# Altium project TM_DE_Main_REV1.0.PrjPcb (part 1 of 2)
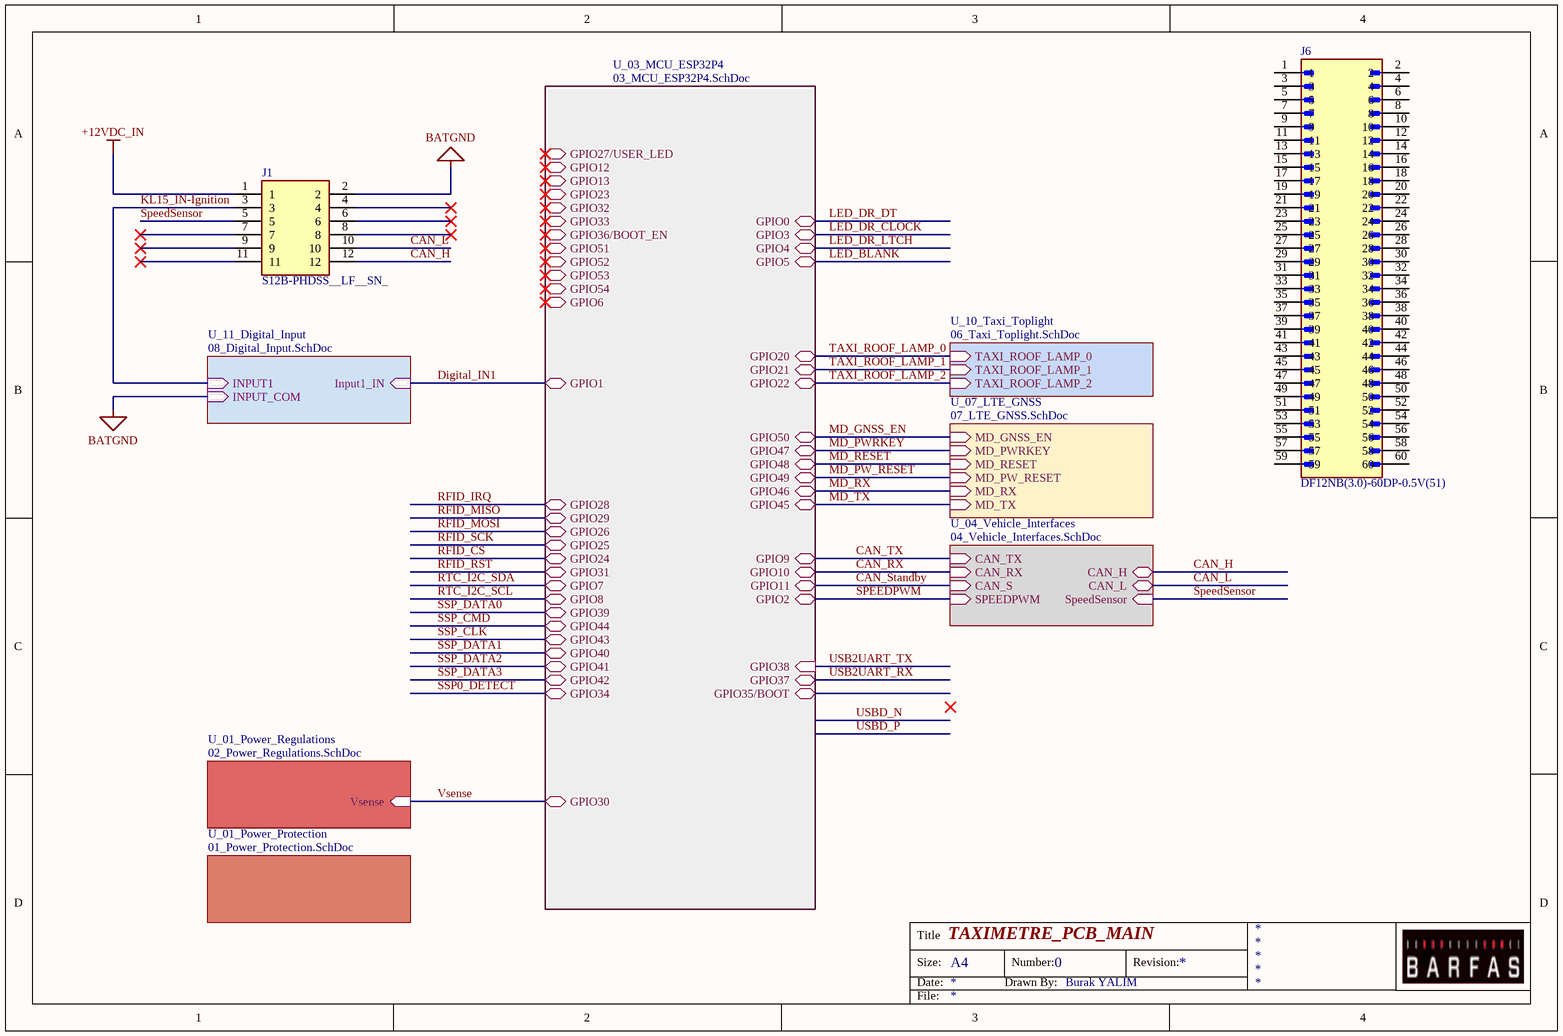
[diagram p0: TOP.SchDoc]
9 sheets, 202 parts. Net scope: hierarchical (ports join the sheet entries above them; power ports are global).
Board file: TM_DE_Main_REV1.0.PcbDoc
Sheets:
  TOP.SchDoc
    U_07_LTE_GNSS = 07_LTE_GNSS.SchDoc
    U_04_Vehicle_Interfaces = 04_Vehicle_Interfaces.SchDoc
    U_03_MCU_ESP32P4 = 03_MCU_ESP32P4.SchDoc
    U_01_Power_Protection = 01_Power_Protection.SchDoc
    U_01_Power_Regulations = 02_Power_Regulations.SchDoc
    U_10_Taxi_Toplight = 06_Taxi_Toplight.SchDoc
    U_11_Digital_Input = 08_Digital_Input.SchDoc
  05_USB_UART_Service.SchDoc

## Sheet TOP.SchDoc: TAXIMETRE_PCB_MAIN
size A4; Author: Burak YALIM; CompanyName: BARFAS; DrawnBy: Burak YALIM; DocumentNumber: 0; SheetNumber: 1; SheetTotal: 12

### Parts
J1  S12B-PHDSS__LF__SN_  [S12BPHDSSLFSN]
J6  DF12NB(3.0)-60DP-0.5V(51)  [HRS_DF12NB(3.0)-60DP-0.5V(51)]

### Sub-sheets
U_01_Power_Protection = 01_Power_Protection.SchDoc: no entries
U_01_Power_Regulations = 02_Power_Regulations.SchDoc: Vsense (in)
U_03_MCU_ESP32P4 = 03_MCU_ESP32P4.SchDoc: GPIO0 (bidir), GPIO1 (bidir), GPIO2 (bidir), GPIO3 (bidir), GPIO4 (bidir), GPIO5 (bidir), GPIO6 (bidir), GPIO7 (bidir), GPIO8 (bidir), GPIO9 (bidir), GPIO10 (bidir), GPIO11 (bidir), GPIO12 (bidir), GPIO13 (bidir), GPIO20 (bidir), GPIO21 (bidir), GPIO22 (bidir), GPIO23 (bidir), GPIO24 (bidir), GPIO25 (bidir), GPIO26 (bidir), GPIO27/USER_LED (bidir), GPIO28 (bidir), GPIO29 (bidir), GPIO30 (bidir), GPIO31 (bidir), GPIO32 (bidir), GPIO33 (bidir), GPIO34 (bidir), GPIO35/BOOT (bidir), GPIO36/BOOT_EN (bidir), GPIO37 (bidir), GPIO38 (in), GPIO39 (bidir), GPIO40 (bidir), GPIO41 (bidir), GPIO42 (bidir), GPIO43 (bidir), GPIO44 (bidir), GPIO45 (bidir), GPIO46 (bidir), GPIO47 (bidir), GPIO48 (bidir), GPIO49 (bidir), GPIO50 (bidir), GPIO51 (bidir), GPIO52 (bidir), GPIO53 (bidir), GPIO54 (bidir)
U_04_Vehicle_Interfaces = 04_Vehicle_Interfaces.SchDoc: CAN_TX (in), CAN_RX (in), CAN_S (in), SPEEDPWM (in), SpeedSensor (in), CAN_H (bidir), CAN_L (bidir)
U_07_LTE_GNSS = 07_LTE_GNSS.SchDoc: MD_GNSS_EN (in), MD_PWRKEY (in), MD_RESET (in), MD_PW_RESET (in), MD_RX (in), MD_TX (in)
U_10_Taxi_Toplight = 06_Taxi_Toplight.SchDoc: TAXI_ROOF_LAMP_0 (in), TAXI_ROOF_LAMP_1 (in), TAXI_ROOF_LAMP_2 (in)
U_11_Digital_Input = 08_Digital_Input.SchDoc: INPUT1 (in), Input1_IN (in), INPUT_COM (in)

### Nets
+12VDC_IN: J1.1
BATGND: J1.2 ; sheet U_11_Digital_Input/INPUT_COM
CAN_H: J1.10 J1.12 ; sheet U_04_Vehicle_Interfaces/CAN_H, sheet U_04_Vehicle_Interfaces/CAN_L  [also labelled CAN_L]
CAN_RX: sheet U_04_Vehicle_Interfaces/CAN_RX, sheet U_03_MCU_ESP32P4/GPIO10
CAN_Standby: sheet U_04_Vehicle_Interfaces/CAN_S, sheet U_03_MCU_ESP32P4/GPIO11
CAN_TX: sheet U_04_Vehicle_Interfaces/CAN_TX, sheet U_03_MCU_ESP32P4/GPIO9
Digital_IN1: sheet U_03_MCU_ESP32P4/GPIO1, sheet U_11_Digital_Input/Input1_IN
KL15_IN-Ignition: J1.3 ; sheet U_11_Digital_Input/INPUT1  [project net INPUT1]
MD_GNSS_EN: sheet U_07_LTE_GNSS/MD_GNSS_EN, sheet U_03_MCU_ESP32P4/GPIO50
MD_PW_RESET: sheet U_07_LTE_GNSS/MD_PW_RESET, sheet U_03_MCU_ESP32P4/GPIO49
MD_PWRKEY: sheet U_07_LTE_GNSS/MD_PWRKEY, sheet U_03_MCU_ESP32P4/GPIO47
MD_RESET: sheet U_07_LTE_GNSS/MD_RESET, sheet U_03_MCU_ESP32P4/GPIO48
MD_RX: sheet U_07_LTE_GNSS/MD_RX, sheet U_03_MCU_ESP32P4/GPIO46
MD_TX: sheet U_07_LTE_GNSS/MD_TX, sheet U_03_MCU_ESP32P4/GPIO45
SPEEDPWM: sheet U_04_Vehicle_Interfaces/SPEEDPWM, sheet U_03_MCU_ESP32P4/GPIO2
SpeedSensor: J1.5 ; sheet U_04_Vehicle_Interfaces/SpeedSensor
TAXI_ROOF_LAMP_0: sheet U_03_MCU_ESP32P4/GPIO20, sheet U_10_Taxi_Toplight/TAXI_ROOF_LAMP_0
TAXI_ROOF_LAMP_1: sheet U_03_MCU_ESP32P4/GPIO21, sheet U_10_Taxi_Toplight/TAXI_ROOF_LAMP_1
TAXI_ROOF_LAMP_2: sheet U_03_MCU_ESP32P4/GPIO22, sheet U_10_Taxi_Toplight/TAXI_ROOF_LAMP_2
Vsense: sheet U_03_MCU_ESP32P4/GPIO30, sheet U_01_Power_Regulations/Vsense

Not connected (* = marked no-connect by the designer): J1 4* 6* 7* 8* 9* 11*; J6 1 2 3 4 5 6 7 8 9 10 11 12 13 14 15 16 17 18 19 20 21 22 23 24 25 26 27 28 29 30 31 32 33 34 35 36 37 38 39 40 41 42 43 44 45 46 47 48 49 50 51 52 53 54 55 56 57 58 59 60

### Notes on the sheet
- Title
- Size:
- Date:
- A4
- Drawn By:
- Number:
- Revision:
- File:

### Library data of the parts
J1 = S12B-PHDSS__LF__SN_: Connector; Manufacturer_Name: JST (JAPAN SOLDERLESS TERMINALS); Manufacturer_Part_Number: S12B-PHDSS (LF)(SN); Datasheet Link: https://www.jst-mfg.com/product/pdf/eng/ePHD.pdf; Height: 5mm
J6 = DF12NB(3.0)-60DP-0.5V(51): 60 Position Connector Header, Outer Shroud Contacts Surface Mount Gold; MF: Hirose Electric Co Ltd; SnapEDA_Link: https://www.snapeda.com/parts/DF12NB(3.0)-60DP-0.5V(51)/Hirose/view-part/?ref=snap; Package: None; Value: *; MP: DF12NB(3.0)-60DP-0.5V(51); Check_prices: https://www.snapeda.com/parts/DF12NB(3.0)-60DP-0.5V(51)/Hirose/view-part/?ref=eda

## Sheet 07_LTE_GNSS.SchDoc: LTE_GNSS
size 420 x 297 mm; SheetNumber: 8; SheetTotal: 12
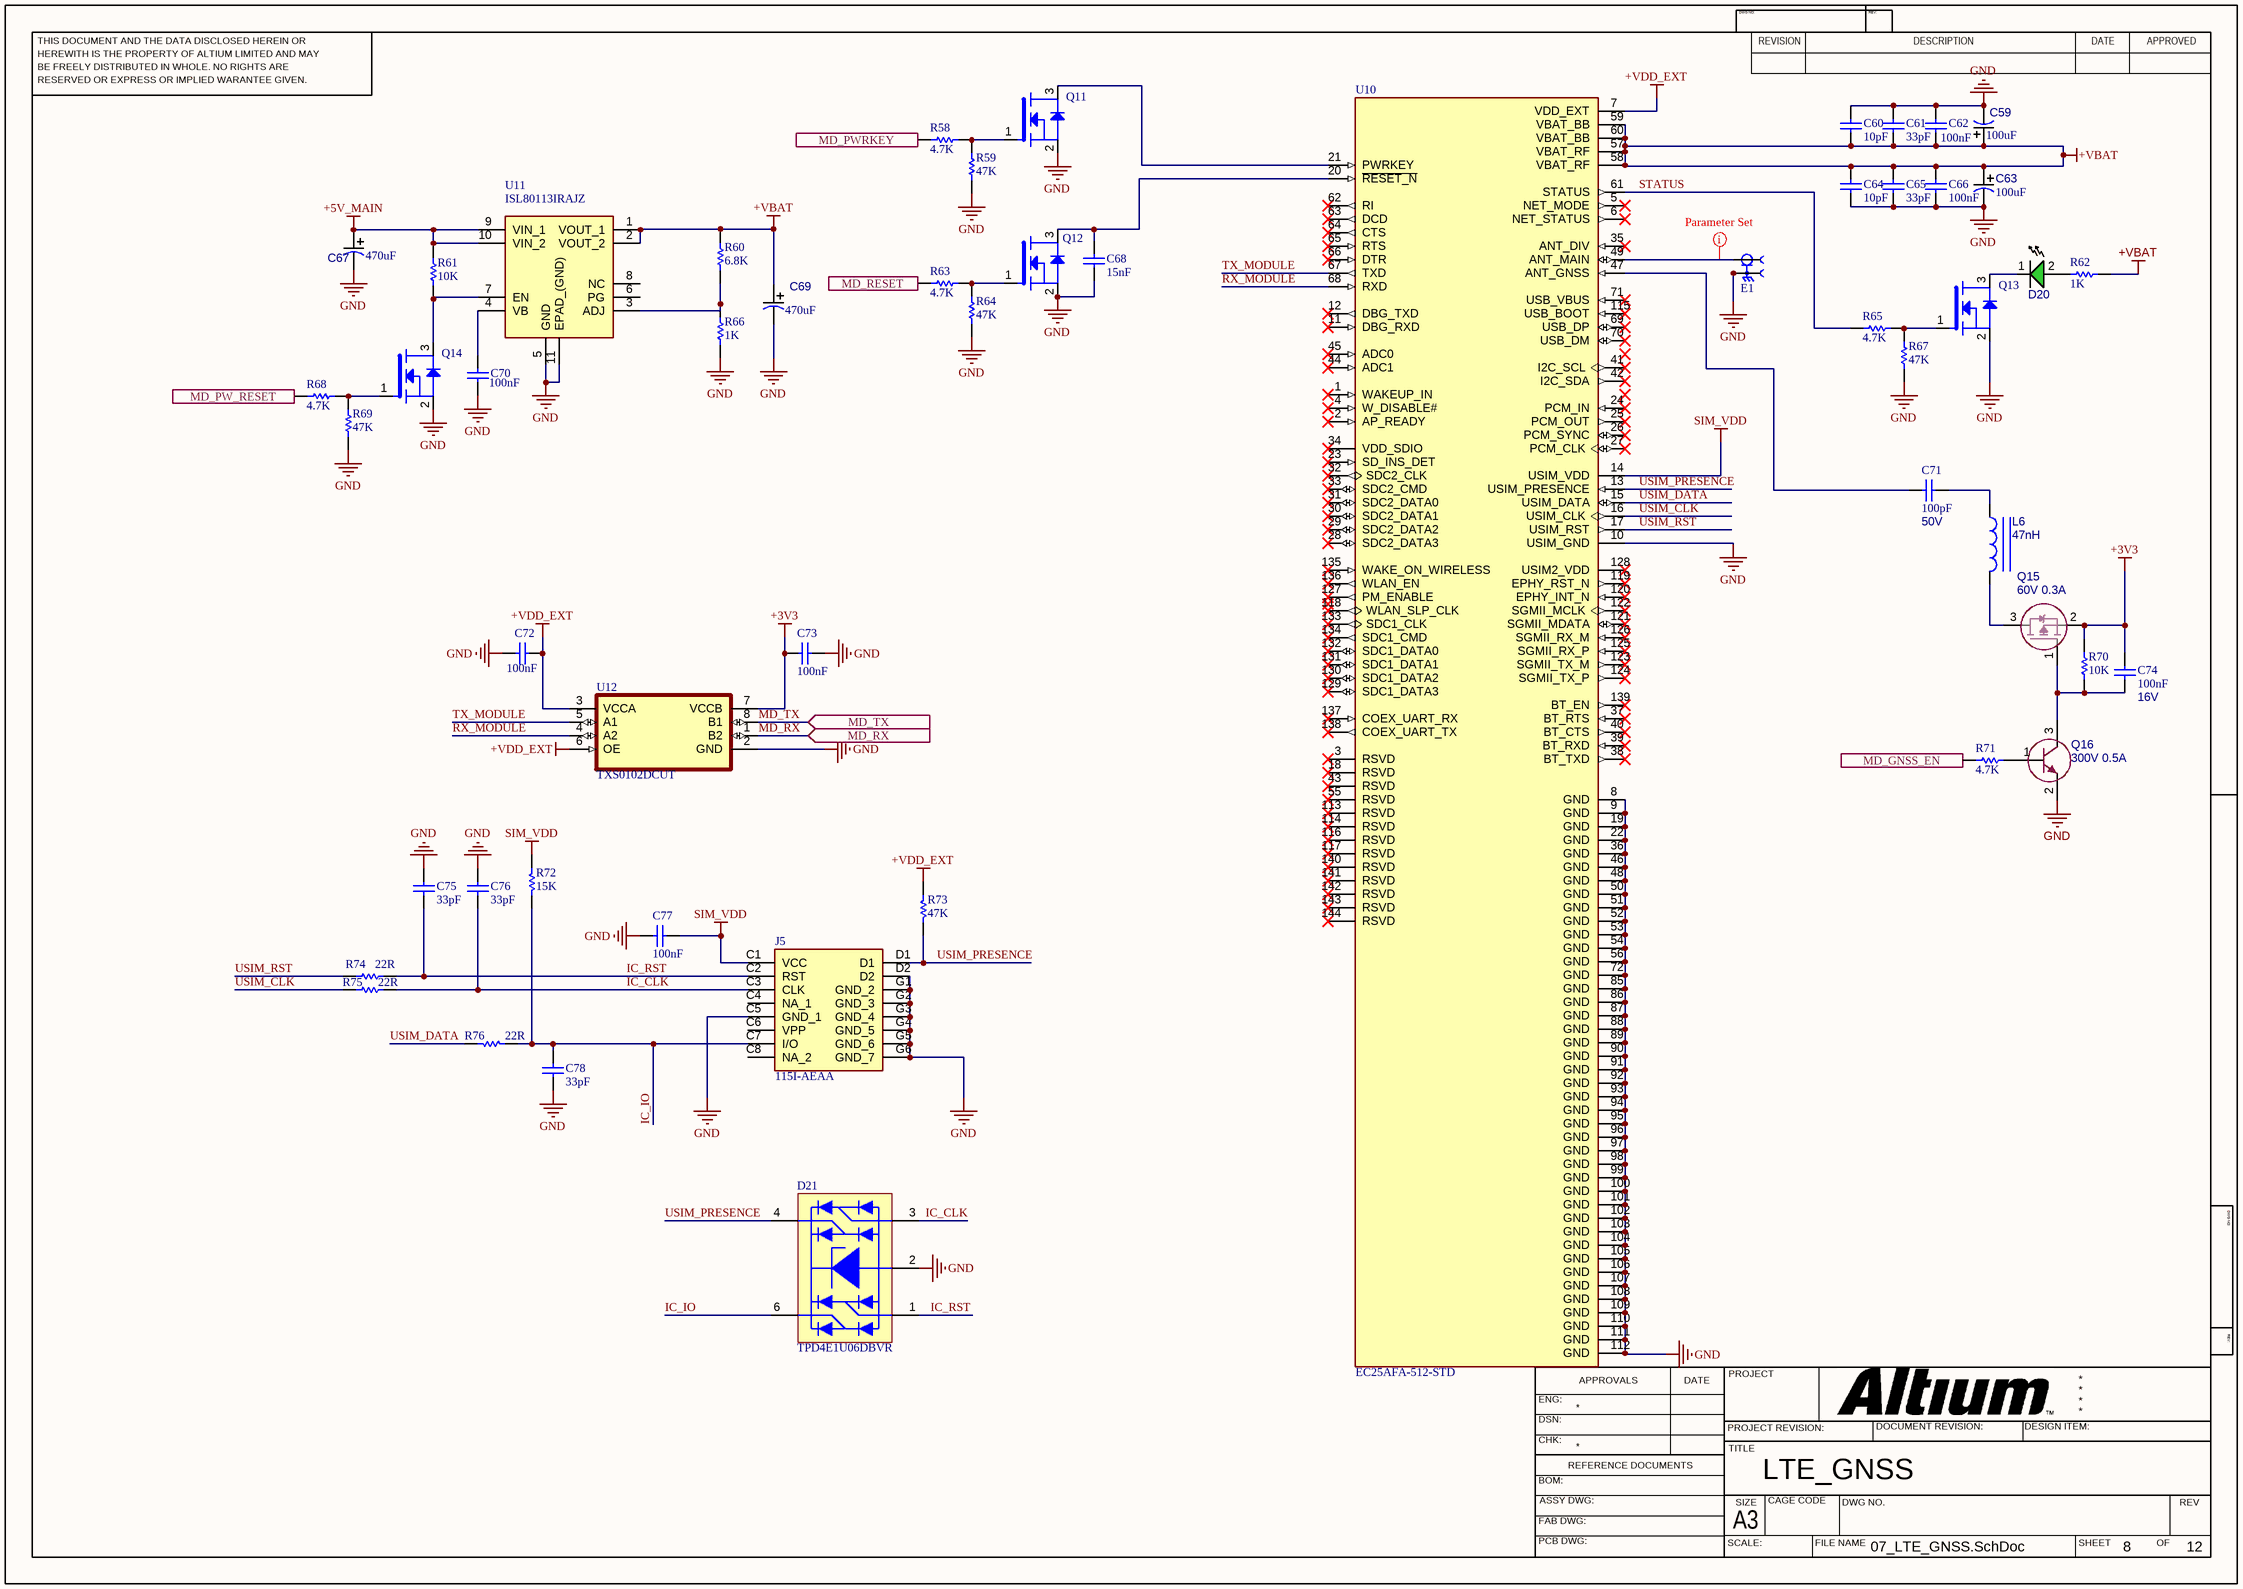
[diagram p1: 07_LTE_GNSS.SchDoc]

### Parts
C59  value 100uF  [TANTALIUM_BCASE]  (hidden comment: T491B107K006AT)
C60  value 10pF  [CAP_0603]  (hidden comment: CL10C100CB8NNNC)
C61  value 33pF  [CAP_0603]  (hidden comment: CL10C330JB8NNNC)
C62  value 100nF  [CAP_0603]  (hidden comment: CL10B104KB8NNNL)
C63  value 100uF  [TANTALIUM_BCASE]  (hidden comment: T491B107K006AT)
C64  value 10pF  [CAP_0603]  (hidden comment: CL10C100CB8NNNC)
C65  value 33pF  [CAP_0603]  (hidden comment: CL10C330JB8NNNC)
C66  value 100nF  [CAP_0603]  (hidden comment: CL10B104KB8NNNL)
C67  value 470uF  [CAP_ELEC_8X10.5 mm]  (hidden comment: MRW-016V471MF105-T/R)
C68  value 15nF  [CAP_0603]  (hidden comment: CL10B153KB85PNC)
C69  value 470uF  [CAP_ELEC_8X10.5 mm]  (hidden comment: MRW-016V471MF105-T/R)
C70  value 100nF  [CAP_0603]  (hidden comment: CL10B104KB8NNNL)
C71  value 100pF  Voltage: 50V  [CAP_0402]  (hidden comment: CC0402JRNPO9BN101)
C72  value 100nF  [CAP_0603]  (hidden comment: CL10B104KB8NNNL)
C73  value 100nF  [CAP_0603]  (hidden comment: CL10B104KB8NNNL)
C74  value 100nF  Voltage: 16V  [CAP_0402]  (hidden comment: CL05B104KO5NNNC)
C75  value 33pF  [CAP_0603]  (hidden comment: CL10C330JB8NNNC)
C76  value 33pF  [CAP_0603]  (hidden comment: CL10C330JB8NNNC)
C77  value 100nF  [CAP_0603]  (hidden comment: CL10B104KB8NNNL)
C78  value 33pF  [CAP_0603]  (hidden comment: CL10C330JB8NNNC)
D20  LTST-C190TGKT  [LED_0603_GREEN]  (value not drawn)
D21  TPD4E1U06DBVR  [SOT23_6]
E1  L-KLS1-SMA002-B  [SMA_JACK_90]  (value not drawn)
J5  115I-AEAA  [115IAEAA]
L6  value 47nH  [RES_0402]  (hidden comment: LQG15HS47NJ02D)
Q11  BSS138W-7-F  [SOT323]  (value not drawn)
Q12  BSS138W-7-F  [SOT323]  (value not drawn)
Q13  BSS138W-7-F  [SOT323]  (value not drawn)
Q14  BSS138W-7-F  [SOT323]  (value not drawn)
Q15  value 60V 0.3A  [SOT23]  (hidden comment: PJA3439_R1_00001)
Q16  value 300V 0.5A  [SOT-23-3]  (hidden comment: MMBTA42_R1_00001)
R58  value 4.7K  [RES_0603]  (hidden comment: 0603SAF4701T5E)
R59  value 47K  [RES_0603]  (hidden comment: 0603SAF4702T5E)
R60  value 6.8K  [RES_0603]  (hidden comment: 0603SAF6801T5E)
R61  value 10K  [RES_0603]  (hidden comment: 0603SAF1002T5E)
R62  value 1K  [RES_0603]  (hidden comment: RES)
R63  value 4.7K  [RES_0603]  (hidden comment: 0603SAF4701T5E)
R64  value 47K  [RES_0603]  (hidden comment: 0603SAF4702T5E)
R65  value 4.7K  [RES_0603]  (hidden comment: 0603SAF4701T5E)
R66  value 1K  [RES_0603]  (hidden comment: 0603SAF1001T5E)
R67  value 47K  [RES_0603]  (hidden comment: 0603SAF4702T5E)
R68  value 4.7K  [RES_0603]  (hidden comment: 0603SAF4701T5E)
R69  value 47K  [RES_0603]  (hidden comment: 0603SAF4702T5E)
R70  value 10K  [RES_0402]  (hidden comment: RC0402JR-0710KL)
R71  value 4.7K  [RES_0603]  (hidden comment: 0603SAF4701T5E)
R72  value 15K  [RES_0603]  (hidden comment: 0603SAJ0153T5E)
R73  value 47K  [RES_0603]  (hidden comment: 0603SAF4702T5E)
R74  value 22R  [RES_0603]  (hidden comment: 0603SAJ0220T5E)
R75  value 22R  [RES_0603]  (hidden comment: 0603SAJ0220T5E)
R76  value 22R  [RES_0603]  (hidden comment: 0603SAJ0220T5E)
U10  EC25AFA-512-STD  [XCVR_EC25AFA-512-STD]
U11  ISL80113IRAJZ  [ISL80101IRAJZ]
U12  TXS0102DCUT  [8_VSSOP]

### Ports
MD_GNSS_EN (in), MD_PW_RESET (in), MD_PWRKEY (in), MD_RESET (in), MD_RX (in), MD_TX (in)

### Nets
+3V3: C73.1 C74.1 Q15.2(S) R70.1 U12.7(VCCB)
+5V_MAIN: C67.1 R61.2 U11.9(VIN_1) U11.10(VIN_2)
+VBAT: C59.1 C60.1 C61.1 C62.1 C63.1 C64.2 C65.2 C66.2 C69.1 R60.2 R62.2 U10.57(VBAT_RF) U10.58(VBAT_RF) U10.59(VBAT_BB) U10.60(VBAT_BB) U11.1(VOUT_1) U11.2(VOUT_2)
+VDD_EXT: C72.1 R73.2 U10.7(VDD_EXT) U12.3(VCCA) U12.6(OE)
GND: C59.2 C60.2 C61.2 C62.2 C63.2 C64.1 C65.1 C66.1 C67.2 C68.1 C69.2 C70.1 C72.2 C73.2 C75.1 C76.1 C77.2 C78.1 D21.2 E1.S1 E1.S2 E1.S3 E1.S4 J5.C5(GND_1) J5.D2 J5.G1(GND_2) J5.G2(GND_3) J5.G3(GND_4) J5.G4(GND_5) J5.G5(GND_6) J5.G6(GND_7) Q11.2(S) Q12.2(S) Q13.2(S) Q14.2(S) Q16.2(E) R59.1 R64.1 R66.1 R67.1 R69.1 U10.8(GND) U10.9(GND) U10.10(USIM_GND) U10.19(GND) U10.22(GND) U10.36(GND) U10.46(GND) U10.48(GND) U10.50(GND) U10.51(GND) U10.52(GND) U10.53(GND) U10.54(GND) U10.56(GND) U10.72(GND) U10.85(GND) U10.86(GND) U10.87(GND) U10.88(GND) U10.89(GND) U10.90(GND) U10.91(GND) U10.92(GND) U10.93(GND) U10.94(GND) U10.95(GND) U10.96(GND) U10.97(GND) U10.98(GND) U10.99(GND) U10.100(GND) U10.101(GND) U10.102(GND) U10.103(GND) U10.104(GND) U10.105(GND) U10.106(GND) U10.107(GND) U10.108(GND) U10.109(GND) U10.110(GND) U10.111(GND) U10.112(GND) U11.5(GND) U11.11(EPAD_(GND)) U12.2(GND)
SIM_VDD: C77.1 J5.C1(VCC) R72.2 U10.14(USIM_VDD)
IC_CLK: C76.2 D21.3 J5.C3(CLK) R75.2
IC_IO: C78.2 D21.6 J5.C7(I/O) R72.1 R76.1
IC_RST: C75.2 D21.1 J5.C2(RST) R74.2
MD_GNSS_EN: R71.1 ; port MD_GNSS_EN
MD_PW_RESET: R68.1 ; port MD_PW_RESET
MD_PWRKEY: R58.1 ; port MD_PWRKEY
MD_RESET: R63.1 ; port MD_RESET
MD_RX: U12.1(B2) ; port MD_RX
MD_TX: U12.8(B1) ; port MD_TX
RX_MODULE: U10.68(RXD) U12.4(A2)
STATUS: R65.1 U10.61(STATUS)
TX_MODULE: U10.67(TXD) U12.5(A1)
USIM_CLK: R75.1 U10.16(USIM_CLK)
USIM_DATA: R76.2 U10.15(USIM_DATA)
USIM_PRESENCE: D21.4 J5.D1 R73.1 U10.13(USIM_PRESENCE)
USIM_RST: R74.1 U10.17(USIM_RST)
NetC68_2: C68.2 Q12.3(D) U10.20(~{RESET_N})
NetC70_2: C70.2 U11.4(VB)
NetC71_1: C71.1 L6.1
NetC71_2: C71.2 U10.47(ANT_GNSS)
NetC74_2: C74.2 Q15.1(G) Q16.3(C) R70.2
NetD20_1: D20.1 Q13.3(D)
NetD20_2: D20.2 R62.1
NetE1_1: E1.1 U10.49(ANT_MAIN)
NetL6_2: L6.2 Q15.3(D)
NetQ11_1: Q11.1(G) R58.2 R59.2
NetQ11_3: Q11.3(D) U10.21(PWRKEY)
NetQ12_1: Q12.1(G) R63.2 R64.2
NetQ13_1: Q13.1(G) R65.2 R67.2
NetQ14_1: Q14.1(G) R68.2 R69.2
NetQ14_3: Q14.3(D) R61.1 U11.7(EN)
NetQ16_1: Q16.1(B) R71.2
NetR60_1: R60.1 R66.2 U11.3(ADJ)

Not connected (* = marked no-connect by the designer): J5 C4(NA_1) C6(VPP) C8(NA_2); U10 1(WAKEUP_IN)* 2(AP_READY)* 3(RSVD)* 4(W_DISABLE#)* 5(NET_MODE)* 6(NET_STATUS)* 11(DBG_RXD)* 12(DBG_TXD)* 18(RSVD)* 23(SD_INS_DET)* 24(PCM_IN)* 25(PCM_OUT)* 26(PCM_SYNC)* 27(PCM_CLK)* 28(SDC2_DATA3)* 29(SDC2_DATA2)* 30(SDC2_DATA1)* 31(SDC2_DATA0)* 32(SDC2_CLK)* 33(SDC2_CMD)* 34(VDD_SDIO)* 35(ANT_DIV)* 37(BT_RTS)* 38(BT_TXD)* 39(BT_RXD)* 40(BT_CTS)* 41(I2C_SCL)* 42(I2C_SDA)* 43(RSVD)* 44(ADC1)* 45(ADC0)* 55(RSVD)* 62(RI)* 63(DCD)* 64(CTS)* 65(RTS)* 66(DTR)* 69(USB_DP)* 70(USB_DM)* 71(USB_VBUS)* 113(RSVD)* 114(RSVD)* 115(USB_BOOT)* 116(RSVD)* 117(RSVD)* 118(WLAN_SLP_CLK)* 119(EPHY_RST_N)* 120(EPHY_INT_N)* 121(SGMII_MDATA)* 122(SGMII_MCLK)* 123(SGMII_TX_M)* 124(SGMII_TX_P)* 125(SGMII_RX_P)* 126(SGMII_RX_M)* 127(PM_ENABLE)* 128(USIM2_VDD)* 129(SDC1_DATA3)* 130(SDC1_DATA2)* 131(SDC1_DATA1)* 132(SDC1_DATA0)* 133(SDC1_CLK)* 134(SDC1_CMD)* 135(WAKE_ON_WIRELESS)* 136(WLAN_EN)* 137(COEX_UART_RX)* 138(COEX_UART_TX)* 139(BT_EN)* 140(RSVD)* 141(RSVD)* 142(RSVD)* 143(RSVD)* 144(RSVD)*; U11 6(PG) 8(NC)

### Layout directives
rule Width Constraint [Pref Width = 0.389mm    Min Width = 0.254mm    Max Width = 0.389mm]: NetE1_1

### Notes on the sheet
- THIS DOCUMENT AND THE DATA DISCLOSED HEREIN OR
- HEREWITH IS THE PROPERTY OF ALTIUM LIMITED AND MAY
- DWG NO:
- REVISION
- REV:
- DESCRIPTION
- DATE
- APPROVED
- BE FREELY DISTRIBUTED IN WHOLE. NO RIGHTS ARE
- RESERVED OR EXPRESS OR IMPLIED WARANTEE GIVEN.
- ENG:
- APPROVALS
- PROJECT
- DSN:
- CHK:
- REFERENCE DOCUMENTS
- PROJECT REVISION:
- TITLE
- DOCUMENT REVISION:
- DESIGN ITEM:
- BOM:
- FAB DWG:
- PCB DWG:
- ASSY DWG:
- SCALE:
- A3
- SIZE
- CAGE CODE
- FILE NAME
- DWG NO.
- SHEET
- OF
- REV

### Library data of the parts
C59 C63 = T491B107K006AT: CAP.TANTAL 100uF 6.3V 10% B CASE (3528) SMD KEMET; Manufacturer: KEMET; Manufacturer Part Number: T491B107K006AT; Supplier 1: Ozdisan
C60 C64 = CL10C100CB8NNNC: MLCC (1608) 0603 10pF 50VDC ±0.25pF C0G (NP0); Manufacturer: SAMSUNG; Supplier 1: Ozdisan; Manufacturer Part Number: CL10C100CB8NNNC
C61 C65 C75 C76 C78 = CL10C330JB8NNNC: MLCC (1608) 0603 33pF 50VDC ±5% C0G (NP0); Manufacturer: Samsung Electro-Mechanics America, Inc; Supplier 1: OZDISAN; Manufacturer Part Number: CL10C330JB8NNNC
C62 C66 C70 C72 C73 C77 = CL10B104KB8NNNL: MLCC (1608) 0603 100nF 50VDC ±10% X7R; Manufacturer: Samsung Electro-Mechanics America, Inc; Supplier 1: OZDISAN; Manufacturer Part Number: CL10B104KB8NNNL
C67 C69 = MRW-016V471MF105-T/R: CAP.EL.470uF 16V 8x10.5 105C 2000Hrs SMD; Manufacturer: KOSHIN; Manufacturer Part Number: MRW-016V471MF105-T/R; Supplier 1: Ozdisan
C68 = CL10B153KB85PNC: MLCC (1608) 0603 15nF 50VDC ±10% X7R AUTOMOTIVE; Manufacturer: SAMSUNG; Supplier 1: OZDISAN; Manufacturer Part Number: CL10B153KB85PNC
C71 = CL10B103KB8NNNL: MLCC (1005) 0402 100pF 50VDC ±5% C0G (NP0); Manufacturer: YAGEO; Manufacturer Part Number: CC0402JRNPO9BN101
C74 = CL10B103KB8NNNL: MLCC (1005) 0402 100nF 16VDC ±10% X7R; Manufacturer: SAMSUNG; Manufacturer Part Number: CL05B104KO5NNNC
D20 = LTST-C190TGKT: LED SMD 0603 GREEN 71-450mcd 130° WATER CLEAR; Manufacturer: LITEON; Package: 0603(1608 Metric); Manufacturer Part Number: LTST-C190TGKT; Value: GREEN
D21 = TPD4E1U06DBVR: DIODE TVS 45W 15V SOT23-6; Manufacturer: TEXAS; Value: *; Supplier 1: OZDISAN; Manufacturer Part Number: TPD4E1U06DBVR
E1 = L-KLS1-SMA002-B: CONNECTOR ANTENNA SMA JACK R/A 50M; Manufacturer: KLS ELECTRONIC; Manufacturer Part Number: L-KLS1-SMA002-B; Supplier 1: OZDISAN
J5 = 115I-AEAA: Connector; Manufacturer_Name: ATTEND; Datasheet Link: https://www.attend.com.tw/data/download/file/115I-AEAA.pdf; Height: 1.52mm; Manufacturer_Part_Number: 115I-AEAA
L6 = CBC3225T100MR: INDUCTOR FIXED 0402 47nH 300mA SMD; Manufacturer: MURATA; Package: 0402 (1005 Metric); Manufacturer Part Number: LQG15HS47NJ02D
Q11-Q14 = BSS138W-7-F: MOSFET DIS.200mA 50V N-CH SC70-3; Manufacturer: DIODES; Value: *; Supplier 1: OZDISAN; Manufacturer Part Number: BSS138W-7-F
Q15 = PJA3439_R1_00001: MOSFET P-CH 60V 300mA SOT23 SMT; Manufacturer: Panjit International Inc.; Package: SOT23; Manufacturer Part Number: PJA3439_R1_00001; Supplier Part Number 1: 3757-PJA3439_R1_00001TR-ND; Supplier Part Number 2: 241-PJA3439_R1_00001; Supplier Part Number 3: PJA3439_R1_00001; Supplier 1: DIGIKEY; Supplier 2: MOUSER; Supplier 3: OZDISAN
Q16 = MMBTA42_R1_00001: TRANSISTOR DIS.500mA 300V NPN SOT23 GEN. SMT; Manufacturer: PANJIT; Package: SOT23; Supplier Part Number 1: 3757-MMBTA42_R1_00001CT-ND; Supplier Part Number 2: *; Supplier Part Number 3: MMBTA42_R1_00001; Supplier 1: DIGIKEY; Supplier 2: MOUSER; Supplier 3: OZDISAN; Manufacturer Part Number: MMBTA42_R1_00001
R58 R63 R65 R68 R71 = 0603SAF4701T5E: RES.(1608) 0603 4.7K Ohms 1% 1/10W-S 100PPM; Manufacturer: ROYALOHM; Supplier 1: Ozdisan; Manufacturer Part Number: 0603SAF4701T5E
R59 R64 R67 R69 R73 = 0603SAF4702T5E: RES.(1608) 0603 47K Ohms 1% 1/10W-S 100PPM; Manufacturer: ROYALOHM; Supplier 1: Ozdisan; Manufacturer Part Number: 0603SAF4702T5E
R60 = 0603SAF6801T5E: RES.(1608) 0603 6.8K Ohms 1% 1/10W-S 100PPM; Manufacturer: ROYALOHM; Supplier 1: Ozdisan; Manufacturer Part Number: 0603SAF6801T5E
R61 = 0603SAF1002T5E: RES.(1608) 0603 10K Ohms 1% 1/10W-S 100PPM; Manufacturer: ROYALOHM; Supplier 1: Ozdisan; Manufacturer Part Number: 0603SAF1002T5E
R62 = R02998: RES 0603 1K Ohms 1% 1/10W-S 100PPM; Manufacturer: ROYALOHM; Manufacturer Part Number: 0603SAF1001T5E
R66 = 0603SAF1001T5E: RES.(1608) 0603 1K Ohms 1% 1/10W-S 100PPM; Manufacturer: ROYALOHM; Supplier 1: Ozdisan; Manufacturer Part Number: 0603SAF1001T5E
R70 = R03000: RES.(1005) 0402 10K Ohms 5% 1/16W 100PPM SMT; Manufacturer: YAGEO; Manufacturer Part Number: RC0402JR-0710KL
R72 = 0603SAJ0153T5E: RES.(1608) 0603 15K Ohms 5% 1/10W-S 100PPM; Manufacturer: ROYALOHM; Supplier 1: Ozdisan; Manufacturer Part Number: 0603SAJ0153T5E
R74-R76 = 0603SAJ0220T5E: RES.(1608) 0603 22 Ohms 5% 1/10W-S 200PPM; Manufacturer: ROYALOHM; Supplier 1: Ozdisan; Manufacturer Part Number: 0603SAJ0220T5E
U10 = EC25AFA-512-STD: Quectel EC25 is a series of 4G - LTE Cat 4 module optimized specially for M2M and IoT applications.; Availability: In Stock; Package: Custom Quectel; MP: EC25AFA-512-STD; SnapEDA_Link: https://www.snapeda.com/parts/EC25AFA-512-STD/Quectel/view-part/?ref=snap; MF: Quectel; Purchase-URL: https://pricing.snapeda.com/search/part/EC25AFA-512-STD/?ref=eda; Value: *; Check_prices: https://www.snapeda.com/parts/EC25AFA-512-STD/Quectel/view-part/?ref=eda; Price: None
U11 = ISL80113IRAJZ: Linear Voltage Regulator IC Positive Adjustable 1 Output 3A 10-DFN (3x3); Manufacturer: Renesas Electronics Corporation; Value: IC REG LINEAR POS ADJ 3A 10DFN; Supplier 1: DIGIKEY; Manufacturer Part Number: ISL80113IRAJZ
U12 = TXS0102DCUT: Voltage Level Translator Bidirectional 1 Circuit 2 Channel 24Mbps 8-VSSOP; Manufacturer: Texas Instruments; Value: *; Supplier 1: DIGIKEY; Manufacturer Part Number: TXS0102DCUT

## Sheet 04_Vehicle_Interfaces.SchDoc: Vehicle Interfaces
size A4; SheetNumber: 5; SheetTotal: 12
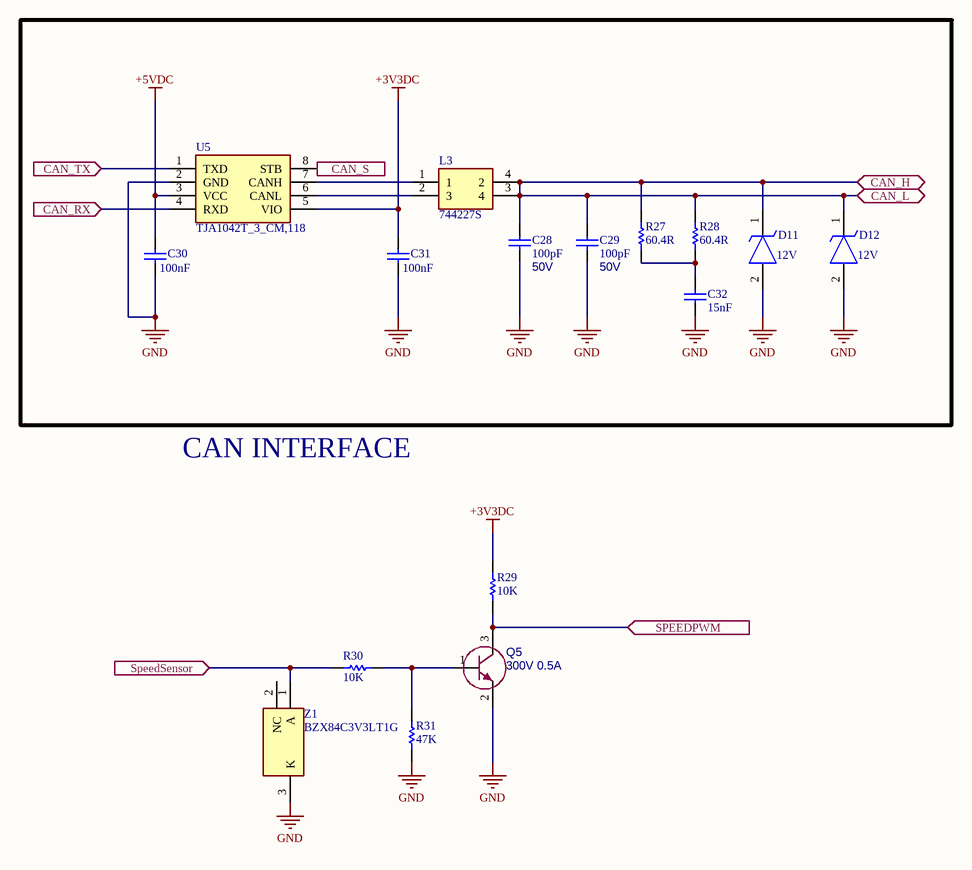
[diagram p2: 04_Vehicle_Interfaces.SchDoc]

### Parts
C28  value 100pF  Voltage: 50V  [CAP_0402]  (hidden comment: CC0402JRNPO9BN101)
C29  value 100pF  Voltage: 50V  [CAP_0402]  (hidden comment: CC0402JRNPO9BN101)
C30  value 100nF  [CAP_0603]  (hidden comment: CL10B104KB8NNNL)
C31  value 100nF  [CAP_0603]  (hidden comment: CL10B104KB8NNNL)
C32  value 15nF  [CAP_0603]  (hidden comment: CL10B153KB85PNC)
D11  value 12V  [DIOM5436X244N]  (hidden comment: SMBJ12A)
D12  value 12V  [DIOM5436X244N]  (hidden comment: SMBJ12A)
L3  744227S  [WE-SL274]
Q5  value 300V 0.5A  [SOT-23-3]  (hidden comment: MMBTA42_R1_00001)
R27  value 60.4R  [RES_0603]  (hidden comment: 0603SAF604JT5E)
R28  value 60.4R  [RES_0603]  (hidden comment: 0603SAF604JT5E)
R29  value 10K  [RES_0402]  (hidden comment: RC0402JR-0710KL)
R30  value 10K  [RES_0402]  (hidden comment: RC0402JR-0710KL)
R31  value 47K  [RES_0603]  (hidden comment: 0603SAF4702T5E)
U5  TJA1042T_3_CM,118  [SOIC127P600X175-8N]
Z1  BZX84C3V3LT1G  [SOT96P237X111-3N]

### Ports
CAN_H (bidir), CAN_L (bidir), CAN_RX (in), CAN_S (in), CAN_TX (in), SPEEDPWM (in), SpeedSensor (in)

### Nets
+3V3DC: C31.2 R29.1 U5.5(VIO)
+5VDC: C30.2 U5.3(VCC)
GND: C28.2 C29.2 C30.1 C31.1 C32.1 D11.2(A) D12.2(A) Q5.2(E) R31.1 U5.2(GND) Z1.3(K)
CAN_H: C28.1 C29.1 D11.1(K) D12.1(K) L3.3(4) L3.4(2) R27.2 R28.2 ; port CAN_H, port CAN_L
CAN_RX: U5.4(RXD) ; port CAN_RX
CAN_Standby: U5.8(STB) ; port CAN_S
CAN_TX: U5.1(TXD) ; port CAN_TX
SPEEDPWM: Q5.3(C) R29.2 ; port SPEEDPWM
SpeedSensor: R30.1 Z1.1(A) ; port SpeedSensor
NetC32_2: C32.2 R27.1 R28.1
NetL3_1: L3.1 U5.7(CANH)
NetL3_2: L3.2(3) U5.6(CANL)
NetQ5_1: Q5.1(B) R30.2 R31.2

Not connected (* = marked no-connect by the designer): Z1 2(NC)

### Notes on the sheet
- CAN INTERFACE
- Title
- Size:
- Date:
- A4
- Drawn By:
- Number:
- Revision:
- File:

### Library data of the parts
C28 C29 = CL10B103KB8NNNL: as C71 on sheet 07_LTE_GNSS; Manufacturer Part Number: CC0402JRNPO9BN101
C30 C31 = CL10B104KB8NNNL: as C62 on sheet 07_LTE_GNSS; Supplier 1: OZDISAN; Manufacturer Part Number: CL10B104KB8NNNL
C32 = CL10B153KB85PNC: as C68 on sheet 07_LTE_GNSS; Supplier 1: OZDISAN; Manufacturer Part Number: CL10B153KB85PNC
D11 D12 = SMBJ12A: TVS, UNI-DIR, 600W, 12V, DO-214A; Manufacturer: Good-Ark Semiconductor; Manufacturer Part Number: SMBJ12A
L3 = 744227S: Inductor; Manufacturer_Name: Wurth Elektronik; Datasheet Link: https://www.we-online.com/catalog/datasheet/744227S.pdf; Height: 5mm; Manufacturer_Part_Number: 744227S; Mouser Part Number: 710-744227S; Mouser Price/Stock: https://www.mouser.co.uk/ProductDetail/Wurth-Elektronik/744227S?qs=PGXP4M47uW6UzRbcLRn7mw%3D%3D
Q5 = MMBTA42_R1_00001: as Q16 on sheet 07_LTE_GNSS; Package: SOT23; Supplier Part Number 1: 3757-MMBTA42_R1_00001CT-ND; Supplier Part Number 2: *; Supplier Part Number 3: MMBTA42_R1_00001; Supplier 1: DIGIKEY; Supplier 2: MOUSER; Supplier 3: OZDISAN; Manufacturer Part Number: MMBTA42_R1_00001
R27 R28 = 0603SAJ0220T5E: RES.(1608) 0603 60.4 Ohms 1% 1/10W-S 200PPM; Manufacturer: ROYALOHM; Supplier 1: Ozdisan; Manufacturer Part Number: 0603SAF604JT5E
R29 R30 = R03000: as R70 on sheet 07_LTE_GNSS; Manufacturer Part Number: RC0402JR-0710KL
R31 = 0603SAF4702T5E: as R59 on sheet 07_LTE_GNSS; Supplier 1: Ozdisan; Manufacturer Part Number: 0603SAF4702T5E
U5 = TJA1042T_3_CM,118: Integrated Circuit; Manufacturer_Name: NXP; Manufacturer_Part_Number: TJA1042T/3/CM,118; Datasheet Link: http://www.nxp.com/docs/en/data-sheet/TJA1042.pdf; Height: 1.75mm; Mouser Part Number: 771-TJA1042T/3/CM118; Mouser Price/Stock: https://www.mouser.co.uk/ProductDetail/NXP-Semiconductors/TJA1042T-3-CM118?qs=vbj%2FKoHZRAjPcMNWVApm4A%3D%3D; Arrow Part Number: TJA1042T/3/CM,118; Arrow Price/Stock: https://www.arrow.com/en/products/tja1042t3cm118/nxp-semiconductors.html?utm_currency=USD&region=nac
Z1 = BZX84C3V3LT1G: Zener Diode; Manufacturer_Name: onsemi; Datasheet Link: https://www.onsemi.com/pub/Collateral/BZX84C2V4LT1-D.PDF; Height: 1.11mm; Manufacturer_Part_Number: BZX84C3V3LT1G; Mouser Part Number: 863-BZX84C3V3LT1G; Mouser Price/Stock: https://www.mouser.co.uk/ProductDetail/onsemi/BZX84C3V3LT1G?qs=vNc2DXHODiIKL62%252Be6h8Pg%3D%3D; Arrow Part Number: BZX84C3V3LT1G; Arrow Price/Stock: https://www.arrow.com/en/products/bzx84c3v3lt1g/on-semiconductor.html?utm_currency=USD&region=nac

## Sheet 03_MCU_ESP32P4.SchDoc: MCU_ESP32P4
size A3; SheetNumber: 4; SheetTotal: 12
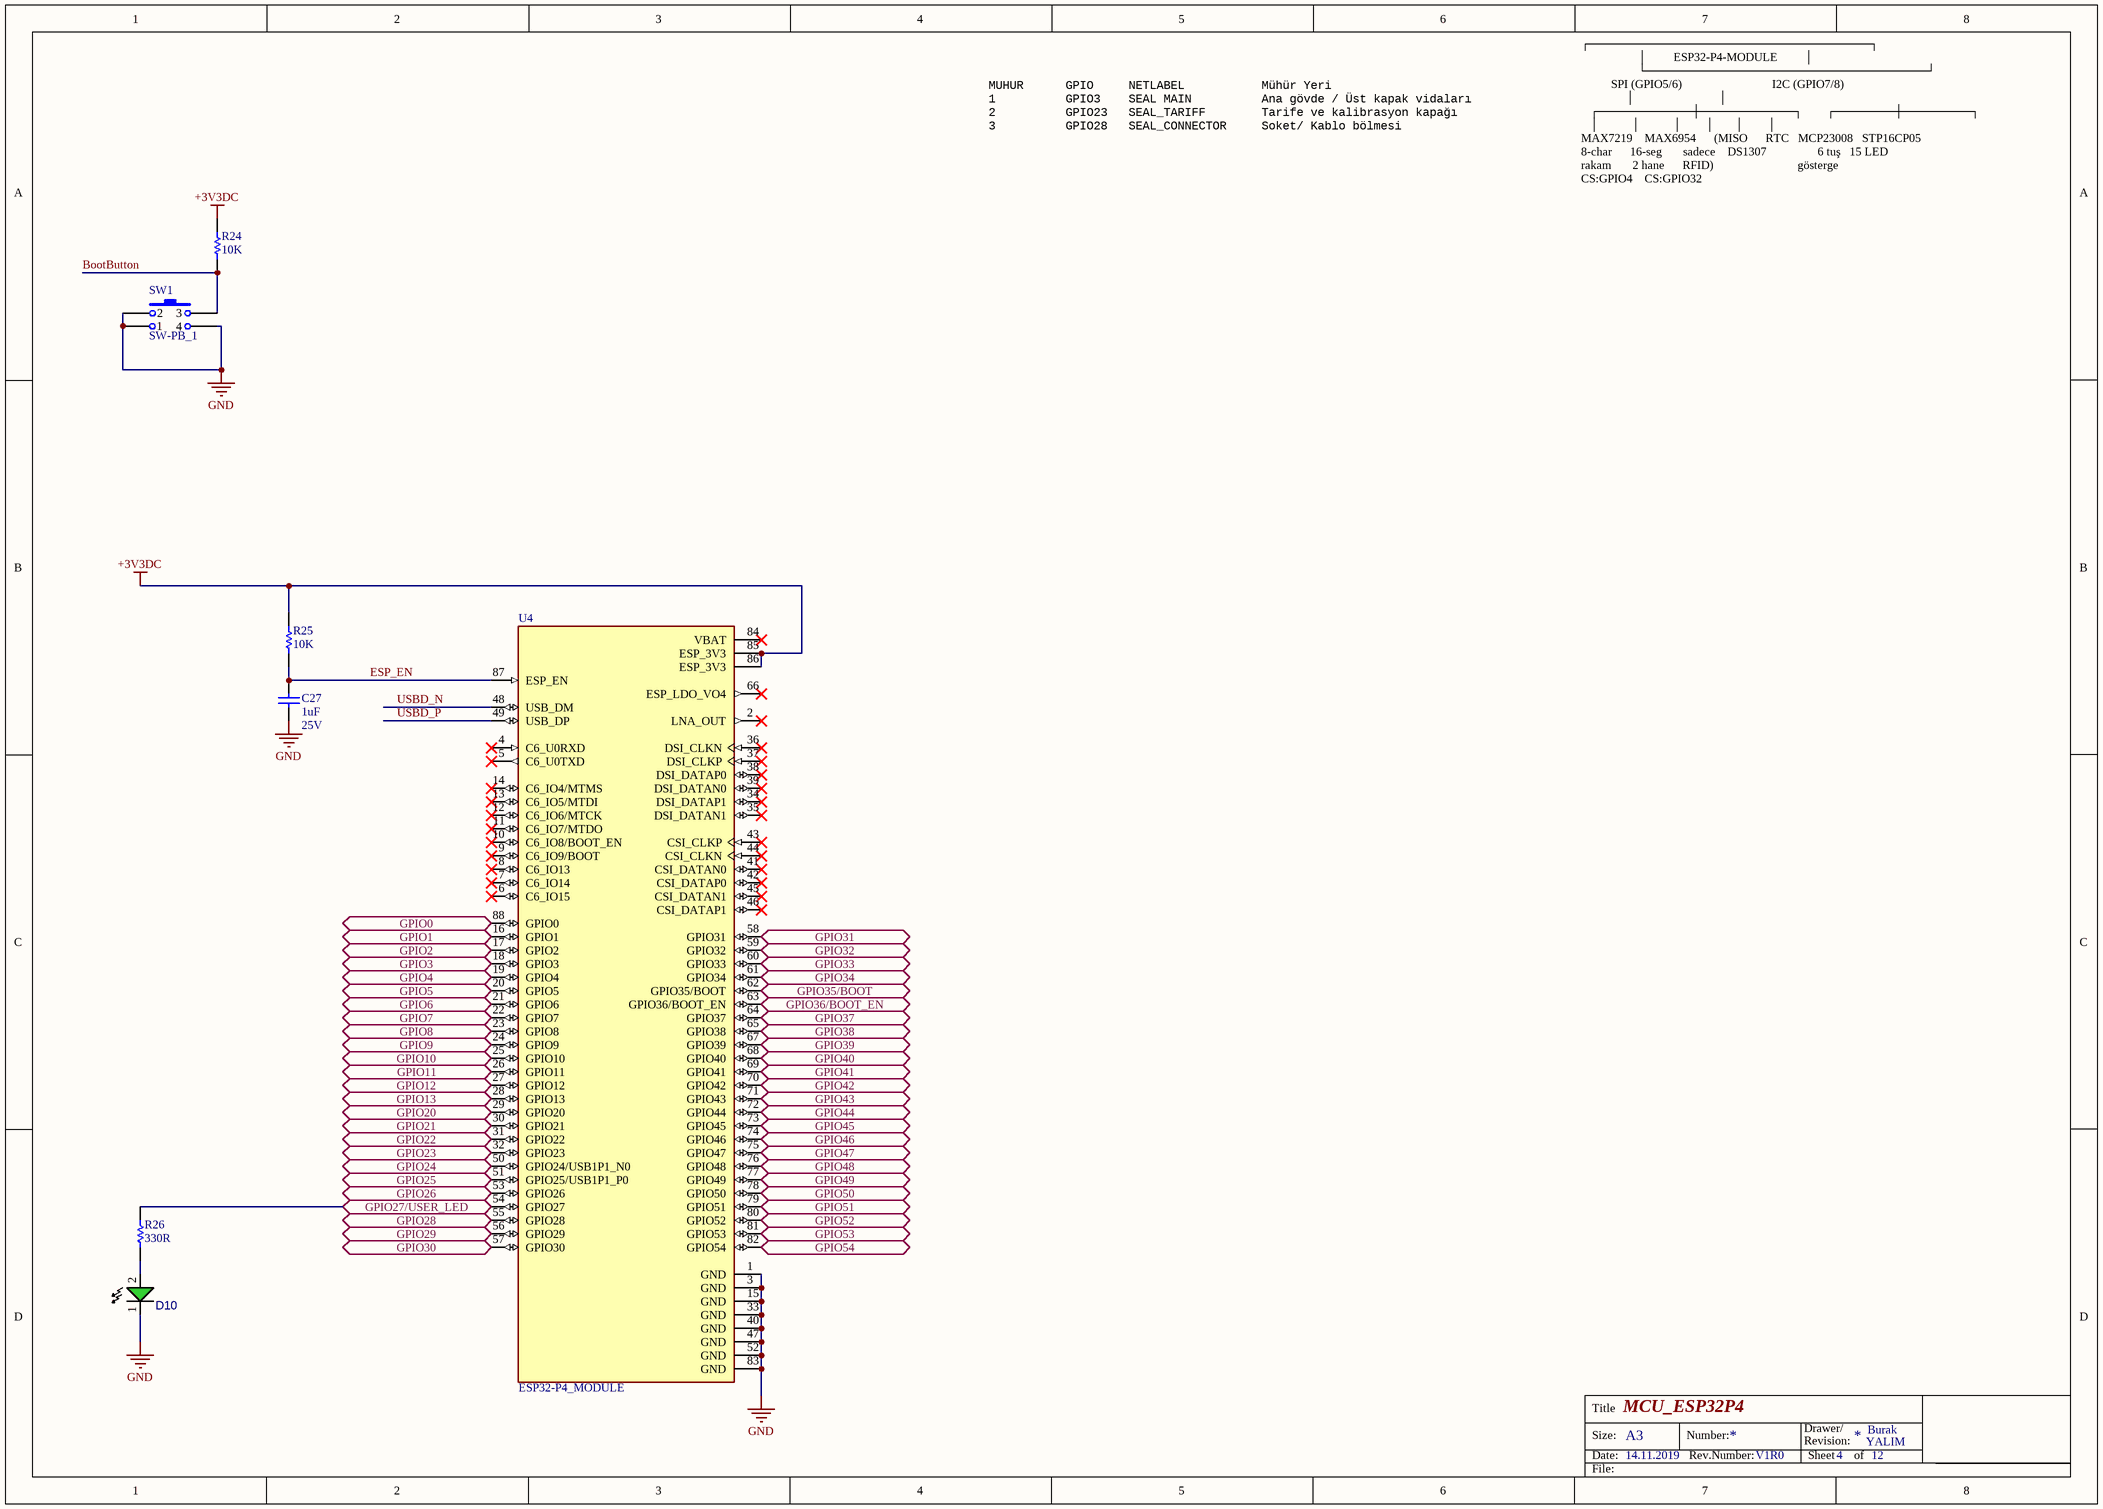
[diagram p3: 03_MCU_ESP32P4.SchDoc]

### Parts
C27  value 1uF  Voltage: 25V  [CAP_0603]  (hidden comment: CL10A105KA8NNNC)
D10  LTST-C190TGKT  [LED_0603_GREEN]  (value not drawn)
R24  value 10K  [RES_0402]  (hidden comment: RC0402JR-0710KL)
R25  value 10K  [RES_0402]  (hidden comment: RC0402JR-0710KL)
R26  value 330R  [RES_0603]  (hidden comment: 0603SAF3300T5E)
SW1  SW-PB_1  [RA_TACT_SWITCH]
U4  ESP32-P4_MODULE  [XCVR_ESP32-P4_MODULE]

### Ports
GPIO0 (bidir), GPIO1 (bidir), GPIO2 (bidir), GPIO3 (bidir), GPIO4 (bidir), GPIO5 (bidir), GPIO6 (bidir), GPIO7 (bidir), GPIO8 (bidir), GPIO9 (bidir), GPIO10 (bidir), GPIO11 (bidir), GPIO12 (bidir), GPIO13 (bidir), GPIO20 (bidir), GPIO21 (bidir), GPIO22 (bidir), GPIO23 (bidir), GPIO24 (bidir), GPIO25 (bidir), GPIO26 (bidir), GPIO27/USER_LED (bidir), GPIO28 (bidir), GPIO29 (bidir), GPIO30 (bidir), GPIO31 (bidir), GPIO32 (bidir), GPIO33 (bidir), GPIO34 (bidir), GPIO35/BOOT (bidir), GPIO36/BOOT_EN (bidir), GPIO37 (bidir), GPIO38 (bidir), GPIO39 (bidir), GPIO40 (bidir), GPIO41 (bidir), GPIO42 (bidir), GPIO43 (bidir), GPIO44 (bidir), GPIO45 (bidir), GPIO46 (bidir), GPIO47 (bidir), GPIO48 (bidir), GPIO49 (bidir), GPIO50 (bidir), GPIO51 (bidir), GPIO52 (bidir), GPIO53 (bidir), GPIO54 (bidir)

### Nets
+3V3DC: R24.2 R25.2 U4.85(ESP_3V3) U4.86(ESP_3V3)
GND: C27.2 D10.1 SW1.1 SW1.2 SW1.4 U4.1(GND) U4.3(GND) U4.15(GND) U4.33(GND) U4.40(GND) U4.47(GND) U4.52(GND) U4.83(GND)
BootButton: R24.1 SW1.3
CAN_RX: U4.25(GPIO10) ; port GPIO10
CAN_Standby: U4.26(GPIO11) ; port GPIO11
CAN_TX: U4.24(GPIO9) ; port GPIO9
Digital_IN1: U4.16(GPIO1) ; port GPIO1
ESP_EN: C27.1 R25.1 U4.87(ESP_EN)
LED_BLANK: U4.20(GPIO5) ; port GPIO5
LED_DR_CLOCK: U4.18(GPIO3) ; port GPIO3
LED_DR_DT: U4.88(GPIO0) ; port GPIO0
LED_DR_LTCH: U4.19(GPIO4) ; port GPIO4
MD_GNSS_EN: U4.78(GPIO50) ; port GPIO50
MD_PW_RESET: U4.77(GPIO49) ; port GPIO49
MD_PWRKEY: U4.75(GPIO47) ; port GPIO47
MD_RESET: U4.76(GPIO48) ; port GPIO48
MD_RX: U4.74(GPIO46) ; port GPIO46
MD_TX: U4.73(GPIO45) ; port GPIO45
RFID_CS: U4.50(GPIO24/USB1P1_N0) ; port GPIO24
RFID_IRQ: U4.55(GPIO28) ; port GPIO28
RFID_MISO: U4.56(GPIO29) ; port GPIO29
RFID_MOSI: U4.53(GPIO26) ; port GPIO26
RFID_RST: U4.58(GPIO31) ; port GPIO31
RFID_SCK: U4.51(GPIO25/USB1P1_P0) ; port GPIO25
RTC_I2C_SCL: U4.23(GPIO8) ; port GPIO8
RTC_I2C_SDA: U4.22(GPIO7) ; port GPIO7
SPEEDPWM: U4.17(GPIO2) ; port GPIO2
SSP0_DETECT: U4.61(GPIO34) ; port GPIO34
SSP_CLK: U4.71(GPIO43) ; port GPIO43
SSP_CMD: U4.72(GPIO44) ; port GPIO44
SSP_DATA0: U4.67(GPIO39) ; port GPIO39
SSP_DATA1: U4.68(GPIO40) ; port GPIO40
SSP_DATA2: U4.69(GPIO41) ; port GPIO41
SSP_DATA3: U4.70(GPIO42) ; port GPIO42
TAXI_ROOF_LAMP_0: U4.29(GPIO20) ; port GPIO20
TAXI_ROOF_LAMP_1: U4.30(GPIO21) ; port GPIO21
TAXI_ROOF_LAMP_2: U4.31(GPIO22) ; port GPIO22
USB2UART_RX: U4.64(GPIO37) ; port GPIO37
USB2UART_TX: U4.65(GPIO38) ; port GPIO38
USBD_N: U4.48(USB_DM)
USBD_P: U4.49(USB_DP)
Vsense: U4.57(GPIO30) ; port GPIO30
NetD10_2: D10.2 R26.1
NetR26_2: R26.2 U4.54(GPIO27) ; port GPIO27/USER_LED
NetU4_21: U4.21(GPIO6) ; port GPIO6
NetU4_27: U4.27(GPIO12) ; port GPIO12
NetU4_28: U4.28(GPIO13) ; port GPIO13
NetU4_32: U4.32(GPIO23) ; port GPIO23
NetU4_59: U4.59(GPIO32) ; port GPIO32
NetU4_60: U4.60(GPIO33) ; port GPIO33
NetU4_62: U4.62(GPIO35/BOOT) ; port GPIO35/BOOT
NetU4_63: U4.63(GPIO36/BOOT_EN) ; port GPIO36/BOOT_EN
NetU4_79: U4.79(GPIO51) ; port GPIO51
NetU4_80: U4.80(GPIO52) ; port GPIO52
NetU4_81: U4.81(GPIO53) ; port GPIO53
NetU4_82: U4.82(GPIO54) ; port GPIO54

Not connected (* = marked no-connect by the designer): U4 2(LNA_OUT)* 4(C6_U0RXD)* 5(C6_U0TXD)* 6(C6_IO15)* 7(C6_IO14)* 8(C6_IO13)* 9(C6_IO9/BOOT)* 10(C6_IO8/BOOT_EN)* 11(C6_IO7/MTDO)* 12(C6_IO6/MTCK)* 13(C6_IO5/MTDI)* 14(C6_IO4/MTMS)* 34(DSI_DATAP1)* 35(DSI_DATAN1)* 36(DSI_CLKN)* 37(DSI_CLKP)* 38(DSI_DATAP0)* 39(DSI_DATAN0)* 41(CSI_DATAN0)* 42(CSI_DATAP0)* 43(CSI_CLKP)* 44(CSI_CLKN)* 45(CSI_DATAN1)* 46(CSI_DATAP1)* 66(ESP_LDO_VO4)* 84(VBAT)*

### Notes on the sheet
- MUHUR      GPIO     NETLABEL           Mühür Yeri
  1          GPIO3    SEAL MAIN          Ana gövde / Üst kapak vidaları
  2          GPIO23   SEAL_TARIFF        Tarife ve kalibrasyon kapağı
  3          GPIO28   SEAL_CONNECTOR     Soket/ Kablo bölmesi
- ┌─────────────────────────────────┐
  │         ESP32-P4-MODULE         │
  └─────────────────────────────────┘
  SPI (GPIO5/6)                              I2C (GPIO7/8)
  │                            │
  ┌───────────┼───────────┐        ┌───────┼────────┐
  │           │           │        │       │        │
  MAX7219    MAX6954      (MISO      RTC   MCP23008   STP16CP05
  8-char      16-seg       sadece    DS1307                 6 tuş   15 LED
  rakam       2 hane      RFID)                            gösterge
  CS:GPIO4    CS:GPIO32
- Title
- Size:
- Date:
- 14.11.2019
- A3
- Number:
- Rev.Number:
- V1R0
- Revision:
- Drawer/
- Sheet
- of
- YALIM
- Burak
- File:

### Library data of the parts
C27 = C01757: CAP CER 1UF 25VDC %10 X5R SMD; Manufacturer: Samsung; Manufacturer Part Number: CL10A105KA8NNNC
D10 = LTST-C190TGKT: as D20 on sheet 07_LTE_GNSS; Package: 0603(1608 Metric); Manufacturer Part Number: LTST-C190TGKT; Value: GREEN
R24 R25 = R03000: as R70 on sheet 07_LTE_GNSS; Manufacturer Part Number: RC0402JR-0710KL
R26 = 0603SAF3300T5E: RES.(1608) 0603 330 Ohms 1% 1/10W-S 100PPM; Manufacturer: ROYALOHM; Supplier 1: Ozdisan; Manufacturer Part Number: 0603SAF3300T5E
SW1 = SW-PB_1: Switch; Part Number: TC-0203T-A00; Unit: USD; Published: 24-Mar-1999; Ordering: https://www.ozdisan.com/elektromekanik-komponentler/sivicler-anahtarlar/tact-sivicler/TC-0203T-A00; Publisher: Altium Limited; Price: 0,06795
U4 = ESP32-P4_MODULE: Dual-core RISC-V high-performance module ESP32-C6H8; Manufacturer: Waveshare Electronics; Manufacturer Part Number: ESP32-P4 Module; Value: *

## Sheet 01_Power_Protection.SchDoc: POWER
size A4; SheetNumber: 2; SheetTotal: 12
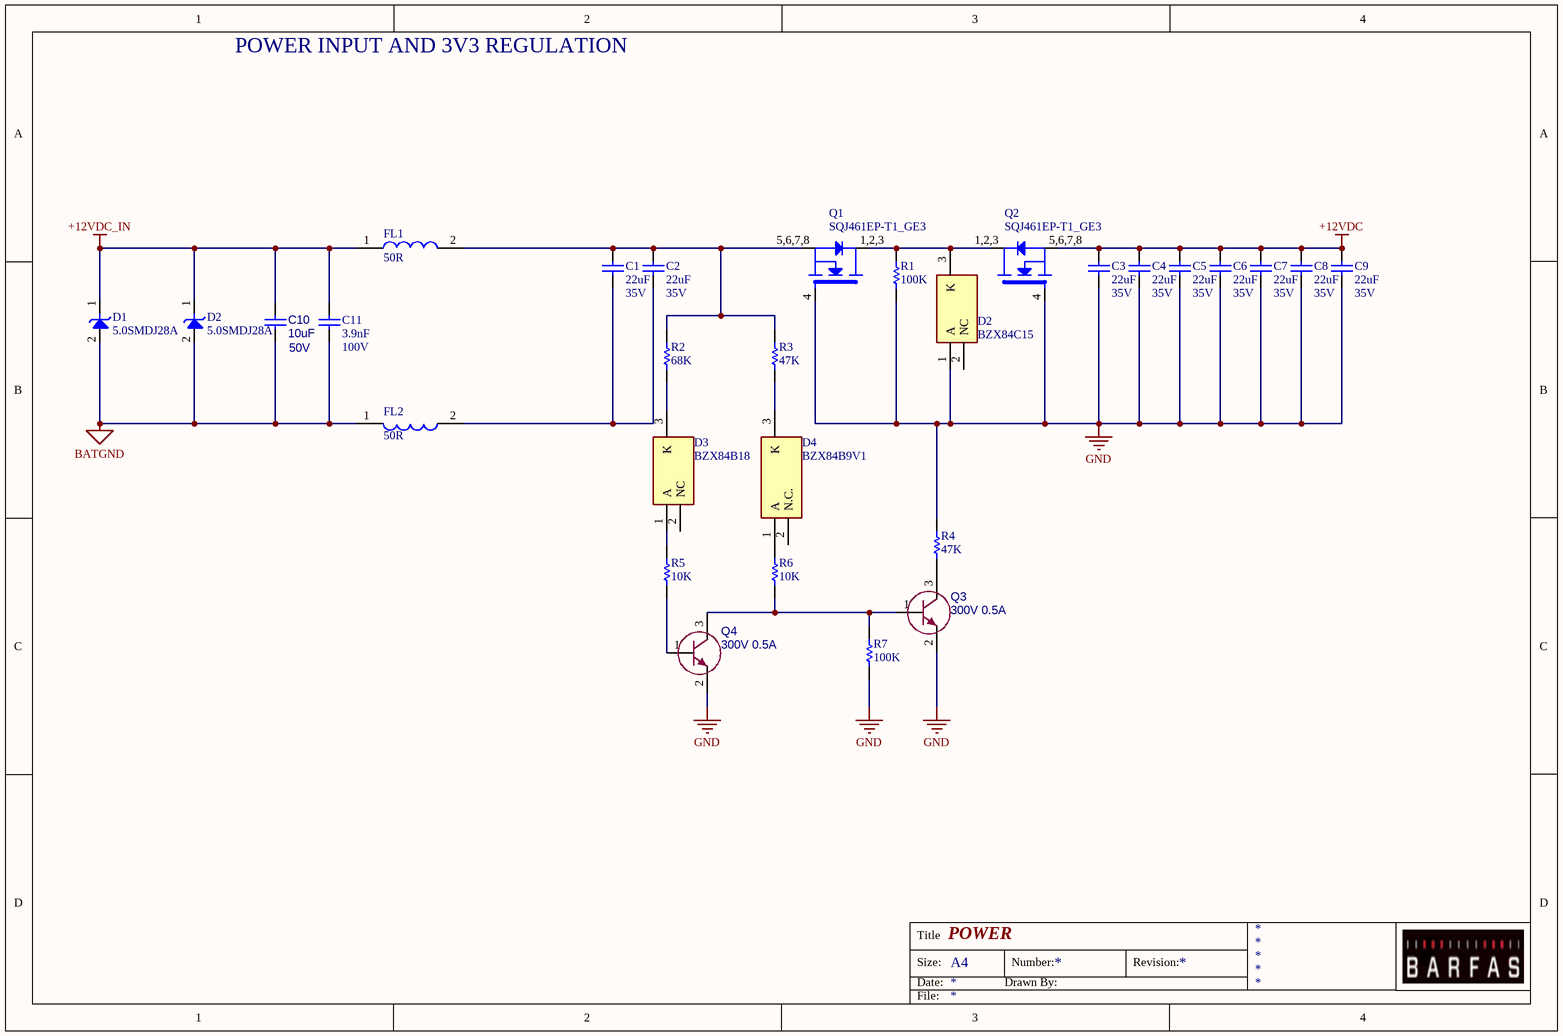
[diagram p4: 01_Power_Protection.SchDoc]

### Parts
(Parts that share a designator on the sheet are numbered #1, #2 ... from top to bottom, then left to right.)
C1  value 22uF  Voltage: 35V  [CAP_0805]  (hidden comment: GMC21X5R226M35NT)
C2  value 22uF  Voltage: 35V  [CAP_0805]  (hidden comment: GMC21X5R226M35NT)
C3  value 22uF  Voltage: 35V  [CAP_0805]  (hidden comment: GMC21X5R226M35NT)
C4  value 22uF  Voltage: 35V  [CAP_0805]  (hidden comment: GMC21X5R226M35NT)
C5  value 22uF  Voltage: 35V  [CAP_0805]  (hidden comment: GMC21X5R226M35NT)
C6  value 22uF  Voltage: 35V  [CAP_0805]  (hidden comment: GMC21X5R226M35NT)
C7  value 22uF  Voltage: 35V  [CAP_0805]  (hidden comment: GMC21X5R226M35NT)
C8  value 22uF  Voltage: 35V  [CAP_0805]  (hidden comment: GMC21X5R226M35NT)
C9  value 22uF  Voltage: 35V  [CAP_0805]  (hidden comment: GMC21X5R226M35NT)
C10  value 10uF  Voltage: 50V  [CAP_1206]  (hidden comment: CL31B106KBHNNNE)
C11  value 3.9nF  Voltage: 100V  [CAP_0603]  (hidden comment: AC0603KRX7R0BB392)
D1  5.0SMDJ28A  [SMCJ58A]
D2#1  5.0SMDJ28A  [SMCJ58A]
D2#2  BZX84C15  [SOT95P240X120-3N]
D3  BZX84B18  [SOT95P240X110-3N]
D4  BZX84B9V1  [SOT95P240X110-3N]
FL1  value 50R  [BLM31AJ601SH1K]  (hidden comment: BLM31SN500SZ1L)
FL2  value 50R  [BLM31AJ601SH1K]  (hidden comment: BLM31SN500SZ1L)
Q1  SQJ461EP-T1_GE3  [SOT323]
Q2  SQJ461EP-T1_GE3  [SOT323]
Q3  value 300V 0.5A  [SOT-23-3]  (hidden comment: MMBTA42_R1_00001)
Q4  value 300V 0.5A  [SOT-23-3]  (hidden comment: MMBTA42_R1_00001)
R1  value 100K  [RES_0402]  (hidden comment: 0402WGF1003TCE)
R2  value 68K  [RES_0402]  (hidden comment: 0402WGF6802TCE)
R3  value 47K  [RES_0603]  (hidden comment: 0603SAF4702T5E)
R4  value 47K  [RES_0603]  (hidden comment: 0603SAF4702T5E)
R5  value 10K  [RES_0402]  (hidden comment: RC0402JR-0710KL)
R6  value 10K  [RES_0402]  (hidden comment: RC0402JR-0710KL)
R7  value 100K  [RES_0402]  (hidden comment: 0402WGF1003TCE)

### Nets
+12VDC: C3.1 C4.1 C5.1 C6.1 C7.1 C8.1 C9.1 Q2.5,6,7,8(S)
+12VDC_IN: C10.1 C11.2 D1.1 D2#1.1 FL1.1
BATGND: C10.2 C11.1 D1.2 D2#1.2 FL2.1
GND: C3.2 C4.2 C5.2 C6.2 C7.2 C8.2 C9.2 D2#2.1(A) Q1.4(G) Q2.4(G) Q3.2(E) Q4.2(E) R1.1 R4.2 R7.1
NetC1_1: C1.1 C2.1 FL1.2 Q1.5,6,7,8(S) R2.2 R3.2
NetC1_2: C1.2 C2.2 FL2.2
NetD2#2_3: D2#2.3(K) Q1.1,2,3(D) Q2.1,2,3(D) R1.2
NetD3_1: D3.1(A) R5.2
NetD3_3: D3.3(K) R2.1
NetD4_1: D4.1(A) R6.2
NetD4_3: D4.3(K) R3.1
NetQ3_1: Q3.1(B) Q4.3(C) R6.1 R7.2
NetQ3_3: Q3.3(C) R4.1
NetQ4_1: Q4.1(B) R5.1

Not connected (* = marked no-connect by the designer): D2#2 2(NC); D3 2(NC); D4 2(N.C.)

### Notes on the sheet
- POWER INPUT AND 3V3 REGULATION
- Title
- Size:
- Date:
- A4
- Drawn By:
- Number:
- Revision:
- File:

### Library data of the parts
C1-C9 = C01758: 22 µF ±20% 35V Ceramic Capacitor X5R 0805 (2012 Metric); Manufacturer: Cal-Chip Electronics, Inc.; Manufacturer Part Number: GMC21X5R226M35NT
C10 = CL31A106KBHNNNE: MLCC (3216) 1206 10uF 50VDC ±10% X7R; Manufacturer: SAMSUNG; Package: 1206 (3216 Metric); Manufacturer Part Number: CL31B106KBHNNNE
C11 = C01763: MLCC (1608) 0603 3.9nF 100VDC ±10% X7R AEC-Q200; Manufacturer: YAGEO; Manufacturer Part Number: AC0603KRX7R0BB392
D1 D2#1 = 5.0SMDJ28A: 45.4V Clamp 110A Ipp Tvs Diode Surface Mount DO-214AB (SMC); Manufacturer: Bourns Inc.; Datasheet Link: https://www.diodes.com/part/view/SMCJ58A; Height: 2.5mm; Manufacturer Part Number: 5.0SMDJ28A; Mouser Part Number: N/A; Mouser Price/Stock: https://www.mouser.co.uk/ProductDetail/Diodes-Incorporated/SMCJ58A?qs=evjyFmOIEsnFZCuxUMyzBg%3D%3D
D2#2 = BZX84C15: Zener Diode; Manufacturer: Diotec; Manufacturer Part Number: BZX84C15
D3 = BZX84B18: Zener Diode; Manufacturer: PANJIT; Manufacturer Part Number: BZX84B18
D4 = BZX84B9V1: Zener Diode; Manufacturer: PANJIT; Manufacturer Part Number: BZX84B9V1
FL1 FL2 = BLM31SN500SZ1L: Ferrite Bead, 50 ohm @ 100 MHz, 12 A, 1206; Manufacturer: Murata Electronics; Manufacturer Part Number: BLM31SN500SZ1L
Q1 Q2 = SQJ461EP-T1_GE3: P-Channel 60 V 30A (Tc) 83W (Tc) Surface Mount PowerPAK® SO-8; Manufacturer: Vishay Siliconix; Value: *; Supplier 1: OZDISAN; Manufacturer Part Number: SQJ461EP-T1_GE3
Q3 Q4 = MMBTA42_R1_00001: as Q16 on sheet 07_LTE_GNSS; Package: SOT23; Supplier Part Number 1: 3757-MMBTA42_R1_00001CT-ND; Supplier Part Number 2: *; Supplier Part Number 3: MMBTA42_R1_00001; Supplier 1: DIGIKEY; Supplier 2: MOUSER; Supplier 3: OZDISAN; Manufacturer Part Number: MMBTA42_R1_00001
R1 R7 = R03000: RES.(1005) 0402 100K Ohms 1% 1/16W 100PPM; Manufacturer: ROYALOHM; Manufacturer Part Number: 0402WGF1003TCE
R2 = R03000: RES.(1005) 0402 68K Ohms 1% 1/16W 100PPM; Manufacturer: ROYALOHM; Manufacturer Part Number: 0402WGF6802TCE
R3 R4 = 0603SAF4702T5E: as R59 on sheet 07_LTE_GNSS; Supplier 1: Ozdisan; Manufacturer Part Number: 0603SAF4702T5E
R5 R6 = R03000: as R70 on sheet 07_LTE_GNSS; Manufacturer Part Number: RC0402JR-0710KL

## Sheet 02_Power_Regulations.SchDoc
size A3; SheetNumber: 3; SheetTotal: 12
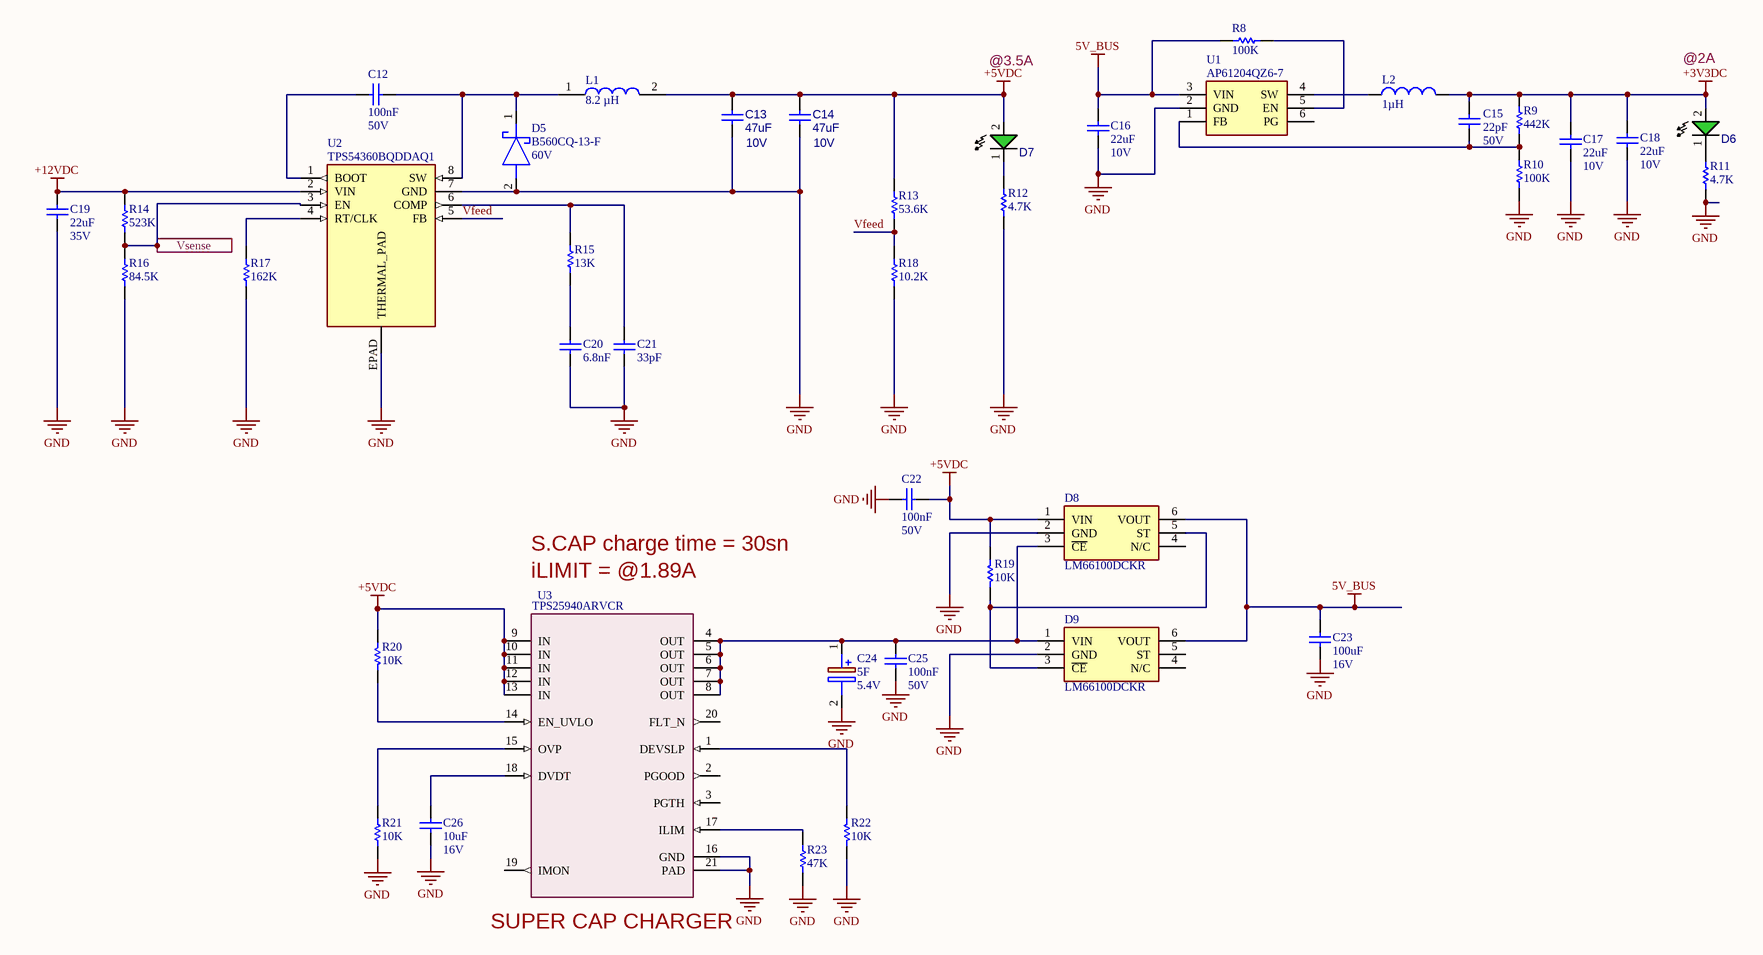
[diagram p5: 02_Power_Regulations.SchDoc]

### Parts
C12  value 100nF  Voltage: 50V  [CAP_0603]  (hidden comment: CAP)
C13  value 47uF  Voltage: 10V  [CAP_1206]  (hidden comment: CL31A476MPHNNNE)
C14  value 47uF  Voltage: 10V  [CAP_1206]  (hidden comment: CL31A476MPHNNNE)
C15  value 22pF  Voltage: 50V  [CAP_0603]  (hidden comment: CAP)
C16  value 22uF  Voltage: 10V  [CAP_0805]  (hidden comment: CL21A226MPCLRNC)
C17  value 22uF  Voltage: 10V  [CAP_0805]  (hidden comment: CL21A226MPCLRNC)
C18  value 22uF  Voltage: 10V  [CAP_0805]  (hidden comment: CL21A226MPCLRNC)
C19  value 22uF  Voltage: 35V  [CAP_0805]  (hidden comment: GMC21X5R226M35NT)
C20  value 6.8nF  [CAP_0603]  (hidden comment: CC0603KRX7R9BB682)
C21  value 33pF  [CAP_0603]  (hidden comment: CL10C330JB8NNNC)
C22  value 100nF  Voltage: 50V  [CAP_0603]  (hidden comment: CAP)
C23  value 100uF  Voltage: 16V  [CAP_1210]  (hidden comment: C1210C107M4PACTU)
C24  value 5F  Voltage: 5.4V  [DRML5R4505_horizonal]  (hidden comment: DRML5R4505)
C25  value 100nF  Voltage: 50V  [CAP_0603]  (hidden comment: CAP)
C26  value 10uF  Voltage: 16V  [CAP_0603]  (hidden comment: CL10A106MO8NQNC)
D5  B560CQ-13-F  value 60V  [DIOM7959X250N]
D6  LTST-C190TGKT  [LED_0603_GREEN]  (value not drawn)
D7  LTST-C190TGKT  [LED_0603_GREEN]  (value not drawn)
D8  LM66100DCKR  [SOP65P210X110-6N]
D9  LM66100DCKR  [SOP65P210X110-6N]
L1  value 8.2 µH  [7447797360]  (hidden comment: 7447797820)
L2  value 1µH  [FPI0302-2R2M]  (hidden comment: FPI0302-1R0M)
R8  value 100K  [RES_0603]  (hidden comment: RES)
R9  value 442K  [RES_0603]  (hidden comment: RES)
R10  value 100K  [RES_0603]  (hidden comment: RES)
R11  value 4.7K  [RES_0603]  (hidden comment: 0603SAF4701T5E)
R12  value 4.7K  [RES_0603]  (hidden comment: 0603SAF4701T5E)
R13  value 53.6K  [RES_0402]  (hidden comment: 0402WGF5362TCE)
R14  value 523K  [RES_0402]  (hidden comment: 0402WGF5233TCE)
R15  value 13K  [RES_0402]  (hidden comment: 0402WGF1302TCE)
R16  value 84.5K  [RES_0402]  (hidden comment: 0402WGF8452TCE)
R17  value 162K  [RES_0402]  (hidden comment: 0402WGF1623TCE)
R18  value 10.2K  [RES_0402]  (hidden comment: 0402WGF1022TCE)
R19  value 10K  [RES_0603]  (hidden comment: RES)
R20  value 10K  [RES_0603]  (hidden comment: RES)
R21  value 10K  [RES_0603]  (hidden comment: RES)
R22  value 10K  [RES_0603]  (hidden comment: RES)
R23  value 47K  [RES_0603]  (hidden comment: RES)
U1  AP61204QZ6-7  [AP61204QZ67]
U2  TPS54360BQDDAQ1  [DDA8_3P1X2P4_TEX]
U3  TPS25940ARVCR  [20-WFQFN Exposed Pad]

### Ports
Vsense (in)

### Nets
5V_BUS: C16.1 C23.2 D8.6(VOUT) D9.6(VOUT) R8.1 U1.3(VIN)
+3V3DC: C15.1 C17.1 C18.1 D6.2 L2.2 R9.1
+5VDC: C13.1 C14.1 C22.2 D7.2 D8.1(VIN) L1.2 R13.1 R19.1 R20.2 U3.9(IN) U3.10(IN) U3.11(IN) U3.12(IN) U3.13(IN)
+12VDC: C19.1 R14.2 U2.2(VIN)
GND: C13.2 C14.2 C16.2 C17.2 C18.2 C19.2 C20.2 C21.2 C22.1 C23.1 C24.2(-) C25.1 C26.1 D5.2(A) D8.2(GND) D9.2(GND) R10.1 R11.1 R12.1 R16.1 R17.1 R18.2 R21.2 R22.2 R23.2 U1.2(GND) U2.7(GND) U2.EPAD(THERMAL_PAD) U3.16(GND) U3.21(PAD)
Vfeed: R13.2 R18.1 U2.5(FB)
Vsense: R14.1 R16.2 U2.3(EN) ; port Vsense
NetC12_1: C12.1 U2.1(BOOT)
NetC12_2: C12.2 D5.1(K) L1.1 U2.8(SW)
NetC15_2: C15.2 R9.2 R10.2 U1.1(FB)
NetC20_1: C20.1 R15.1
NetC21_1: C21.1 R15.2 U2.6(COMP)
NetC24_1: C24.1(+) C25.2 D8.3(~{CE}) D9.1(VIN) U3.4(OUT) U3.5(OUT) U3.6(OUT) U3.7(OUT) U3.8(OUT)
NetC26_2: C26.2 U3.18(DVDT)
NetD6_1: D6.1 R11.2
NetD7_1: D7.1 R12.2
NetD8_5: D8.5(ST) D9.3(~{CE}) R19.2
NetL2_1: L2.1 U1.4(SW)
NetR8_2: R8.2 U1.5(EN)
NetR17_2: R17.2 U2.4(RT/CLK)
NetR20_1: R20.1 U3.14(EN_UVLO)
NetR21_1: R21.1 U3.15(OVP)
NetR22_1: R22.1 U3.1(DEVSLP)
NetR23_1: R23.1 U3.17(ILIM)

Not connected (* = marked no-connect by the designer): D8 4(N/C); D9 4(N/C) 5(ST); U1 6(PG); U3 2(PGOOD) 3(PGTH) 19(IMON) 20(FLT_N)

### Notes on the sheet
- @3.5A
- @2A
- iLIMIT = @1.89A
- S.CAP charge time = 30sn
- (near U3) SUPER CAP CHARGER
- Title
- Size:
- Date:
- 14.11.2019
- A3
- Number:
- Rev.Number:
- V1R0
- Revision:
- Drawer/
- Sheet
- of
- YALIM
- Burak
- File:

### Library data of the parts
C12 C22 C25 = C01763: CAP CER 100nF 50VDC %10 X7R SMD; Manufacturer: Samsung; Manufacturer Part Number: CL10B104KB8NNNL
C13 C14 = CL31A106KBHNNNE: MLCC (3216) 1206 47uF 10VDC ±20% X5R; Manufacturer: SAMSUNG; Package: 1206 (3216 Metric); Manufacturer Part Number: CL31A476MPHNNNE
C15 = C01769: MLCC 0603 22pF 50VDC ±5% C0G (NP0); Manufacturer: Samsung; Manufacturer Part Number: CL10C220JB8NNNC
C16-C18 = C01758: MLCC (2012) 0805 22uF 10VDC ±20% X5R; Manufacturer: Samsung; Manufacturer Part Number: CL21A226MPCLRNC
C19 = C01758: as C1 on sheet 01_Power_Protection; Manufacturer Part Number: GMC21X5R226M35NT
C20 = CL10C330JB8NNNC: MLCC (1608) 0603 6.8nF 50VDC ±10% X7R; Manufacturer: YAGEO; Supplier 1: OZDISAN; Manufacturer Part Number: CC0603KRX7R9BB682
C21 = CL10C330JB8NNNC: as C61 on sheet 07_LTE_GNSS; Supplier 1: OZDISAN; Manufacturer Part Number: CL10C330JB8NNNC
C23 = C01763: MLCC (3225) 1210 100uF 16VDC ±20% X5R; Manufacturer: KEMET; Manufacturer Part Number: C1210C107M4PACTU
C24 = DRML5R4505: CAP.SUPER 5F 5.4V SIZE 20.5x10.0x26.0; Manufacturer: KORCHIP; Manufacturer Part Number: DRML5R4505
C26 = C01763: MLCC (1608) 0603 10uF 16VDC ±20% X5R; Manufacturer: Samsung; Manufacturer Part Number: CL10A106MO8NQNC
D5 = B560CQ-13-F: DIODE SCHOTTKY 60V 5A SMC; Manufacturer: Diodes Incorporated; Manufacturer Part Number: B560CQ-13-F
D6 D7 = LTST-C190TGKT: as D20 on sheet 07_LTE_GNSS; Package: 0603(1608 Metric); Manufacturer Part Number: LTST-C190TGKT; Value: GREEN
D8 D9 = LM66100DCKR: Diode; Manufacturer_Name: Texas Instruments; Datasheet Link: http://www.ti.com/lit/gpn/LM66100; Height: 1.1mm; Manufacturer_Part_Number: LM66100DCKR; Mouser Part Number: 595-LM66100DCKR; Mouser Price/Stock: https://www.mouser.co.uk/ProductDetail/Texas-Instruments/LM66100DCKR?qs=vLWxofP3U2y2yPPrXoBBoA%3D%3D; Arrow Part Number: LM66100DCKR; Arrow Price/Stock: https://www.arrow.com/en/products/lm66100dckr/texas-instruments.html?utm_currency=USD&region=nac
L1 = 7447797820: 8.2 µH Shielded Drum Core, Wirewound Inductor 5.05 A 28.6mOhm Max Nonstandard; Manufacturer: Wurth Elektronik; Manufacturer Part Number: 7447797820
L2 = IND0000019: INDUCTOR POWER 1UH 3.3X3MM SMD; Manufacturer: Core Master; Manufacturer Part Number: FPI0302-1R0M
R8 R10 = R03011: RES 0603 100K Ohms 1% 1/10W-S 100PPM; Manufacturer: ROYALOHM; Manufacturer Part Number: 0603SAF1003T5E
R9 = R03014: RES 0603 442K Ohms 1% 1/10W-S 100PPM; Manufacturer: ROYALOHM; Manufacturer Part Number: 0603SAF4423T5E
R11 R12 = 0603SAF4701T5E: as R58 on sheet 07_LTE_GNSS; Supplier 1: Ozdisan; Manufacturer Part Number: 0603SAF4701T5E
R13 = R03000: RES.(1005) 0402 53.6K Ohms 1% 1/16W 100PPM; Manufacturer: ROYALOHM; Manufacturer Part Number: 0402WGF5362TCE
R14 = R03000: RES.(1005) 0402 523K Ohms 1% 1/16W 100PPM; Manufacturer: ROYALOHM; Manufacturer Part Number: 0402WGF5233TCE
R15 = R03000: RES.(1005) 0402 13K Ohms 1% 1/16W 100PPM; Manufacturer: ROYALOHM; Manufacturer Part Number: 0402WGF1302TCE
R16 = R03000: RES.(1005) 0402 84.5K Ohms 1% 1/16W 100PPM; Manufacturer: ROYALOHM; Manufacturer Part Number: 0402WGF8452TCE
R17 = R03000: RES.(1005) 0402 162K Ohms 1% 1/16W 100PPM; Manufacturer: ROYALOHM; Manufacturer Part Number: 0402WGF1623TCE
R18 = R03000: RES.(1005) 0402 10.2K Ohms 1% 1/16W 100PPM; Manufacturer: ROYALOHM; Manufacturer Part Number: 0402WGF1022TCE
R19-R22 = R02995: RES 0603 10k Ohms %1 1/10W 100PPM; Manufacturer: ROYALOHM; Manufacturer Part Number: 0603SAF1002T5E
R23 = R03000: RES 0603 47K Ohms 1% 1/10W-S 100PPM; Manufacturer: ROYALOHM; Manufacturer Part Number: 0603SAF4702T5E
U1 = AP61204QZ6-7: Integrated Circuit; Manufacturer_Name: Diodes Incorporated; Datasheet Link: https://www.diodes.com/datasheet/download/AP61204Q.pdf; Height: 0.6mm; Manufacturer_Part_Number: AP61204QZ6-7
U2 = TPS54360BQDDAQ1: Automotive, 60V Input, 3.5A, Step-Down DC-DC Converter With Eco-mode&trade; 8-SO PowerPAD -40 to 125; Manufacturer: Texas Instruments; Copyright: Copyright (C) 2026 Ultra Librarian. All rights reserved.; Manufacturer Part Number: TPS54360BQDDAQ1; RefDes: RefDes; Type: Type
U3 = TPS25940ARVCR: IC ELECTRONIC FUSE 8% 20WQFN; Manufacturer: Texas Instruments; Value: TPS25940ARVCR; Manufacturer Part Number: TPS25940ARVCR

## Sheet 06_Taxi_Toplight.SchDoc: Taxi_Toplight
size A4; SheetNumber: 11; SheetTotal: 12
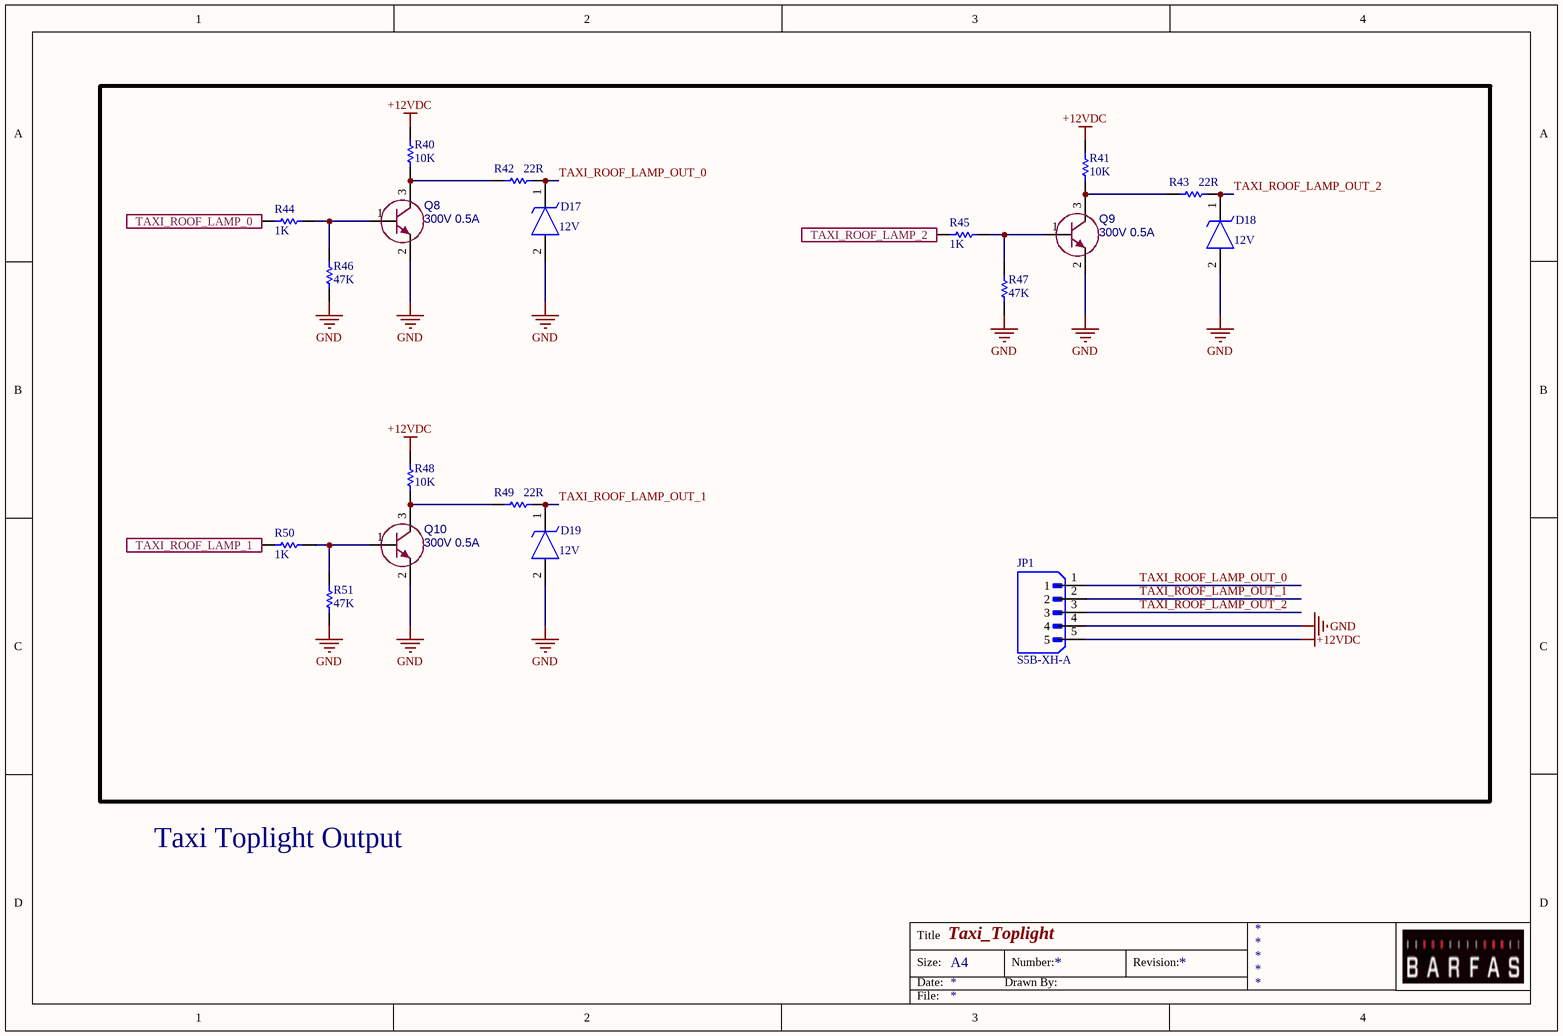
[diagram p6: 06_Taxi_Toplight.SchDoc]

### Parts
D17  value 12V  [DIOM5436X244N]  (hidden comment: SMBJ12A)
D18  value 12V  [DIOM5436X244N]  (hidden comment: SMBJ12A)
D19  value 12V  [DIOM5436X244N]  (hidden comment: SMBJ12A)
JP1  S5B-XH-A  [JST_S5B-XH-A]
Q8  value 300V 0.5A  [SOT-23-3]  (hidden comment: MMBTA42_R1_00001)
Q9  value 300V 0.5A  [SOT-23-3]  (hidden comment: MMBTA42_R1_00001)
Q10  value 300V 0.5A  [SOT-23-3]  (hidden comment: MMBTA42_R1_00001)
R40  value 10K  [RES_0402]  (hidden comment: RC0402JR-0710KL)
R41  value 10K  [RES_0402]  (hidden comment: RC0402JR-0710KL)
R42  value 22R  [RES_0603]  (hidden comment: 0603SAJ0220T5E)
R43  value 22R  [RES_0603]  (hidden comment: 0603SAJ0220T5E)
R44  value 1K  [RES_0603]  (hidden comment: 0603SAF1001T5E)
R45  value 1K  [RES_0603]  (hidden comment: 0603SAF1001T5E)
R46  value 47K  [RES_0603]  (hidden comment: 0603SAF4702T5E)
R47  value 47K  [RES_0603]  (hidden comment: 0603SAF4702T5E)
R48  value 10K  [RES_0402]  (hidden comment: RC0402JR-0710KL)
R49  value 22R  [RES_0603]  (hidden comment: 0603SAJ0220T5E)
R50  value 1K  [RES_0603]  (hidden comment: 0603SAF1001T5E)
R51  value 47K  [RES_0603]  (hidden comment: 0603SAF4702T5E)

### Ports
TAXI_ROOF_LAMP_0 (in), TAXI_ROOF_LAMP_1 (in), TAXI_ROOF_LAMP_2 (in)

### Nets
+12VDC: JP1.5 R40.1 R41.1 R48.1
GND: D17.2(A) D18.2(A) D19.2(A) JP1.4 Q8.2(E) Q9.2(E) Q10.2(E) R46.1 R47.1 R51.1
TAXI_ROOF_LAMP_0: R44.2 ; port TAXI_ROOF_LAMP_0
TAXI_ROOF_LAMP_1: R50.2 ; port TAXI_ROOF_LAMP_1
TAXI_ROOF_LAMP_2: R45.2 ; port TAXI_ROOF_LAMP_2
TAXI_ROOF_LAMP_OUT_0: D17.1(K) JP1.1 R42.2
TAXI_ROOF_LAMP_OUT_1: D19.1(K) JP1.2 R49.2
TAXI_ROOF_LAMP_OUT_2: D18.1(K) JP1.3 R43.2
NetQ8_1: Q8.1(B) R44.1 R46.2
NetQ8_3: Q8.3(C) R40.2 R42.1
NetQ9_1: Q9.1(B) R45.1 R47.2
NetQ9_3: Q9.3(C) R41.2 R43.1
NetQ10_1: Q10.1(B) R50.1 R51.2
NetQ10_3: Q10.3(C) R48.2 R49.1

### Notes on the sheet
- Taxi Toplight Output
- Title
- Size:
- Date:
- A4
- Drawn By:
- Number:
- Revision:
- File:

### Library data of the parts
D17-D19 = SMBJ12A: as D11 on sheet 04_Vehicle_Interfaces; Manufacturer Part Number: SMBJ12A
JP1 = S5B-XH-A: Connector Header Through Hole, Right Angle 5 position 0.098 (2.50mm); MF: JST Sales; SnapEDA_Link: https://www.snapeda.com/parts/S5B-XH-A/JST+Sales+America+Inc./view-part/?ref=snap; Package: None; Value: *; MP: S5B-XH-A; Check_prices: https://www.snapeda.com/parts/S5B-XH-A/JST+Sales+America+Inc./view-part/?ref=eda
Q8-Q10 = MMBTA42_R1_00001: as Q16 on sheet 07_LTE_GNSS; Package: SOT23; Supplier Part Number 1: 3757-MMBTA42_R1_00001CT-ND; Supplier Part Number 2: *; Supplier Part Number 3: MMBTA42_R1_00001; Supplier 1: DIGIKEY; Supplier 2: MOUSER; Supplier 3: OZDISAN; Manufacturer Part Number: MMBTA42_R1_00001
R40 R41 R48 = R03000: as R70 on sheet 07_LTE_GNSS; Manufacturer Part Number: RC0402JR-0710KL
R42 R43 R49 = 0603SAJ0220T5E: as R74 on sheet 07_LTE_GNSS; Supplier 1: Ozdisan; Manufacturer Part Number: 0603SAJ0220T5E
R44 R45 R50 = 0603SAF1001T5E: as R66 on sheet 07_LTE_GNSS; Supplier 1: Ozdisan; Manufacturer Part Number: 0603SAF1001T5E
R46 R47 R51 = 0603SAF4702T5E: as R59 on sheet 07_LTE_GNSS; Supplier 1: Ozdisan; Manufacturer Part Number: 0603SAF4702T5E

## Sheet 08_Digital_Input.SchDoc
size A4; SheetNumber: 12; SheetTotal: 12
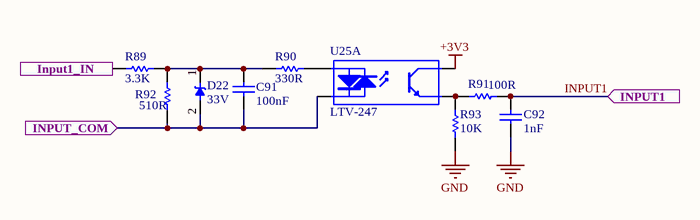
[diagram p7: 08_Digital_Input.SchDoc]

### Parts
C91  value 100nF  [CAP_0603]  (hidden comment: CL10B104KB8NNNL)
C92  value 1nF  [CAP_0603]  (hidden comment: CL10B102KB8NNNL)
D22  value 33V  [DO214AC_SMA___]  (hidden comment: P4SMAJ33A_R1_00001)
R89  value 3.3K  [RES_0603]  (hidden comment: 0603SAJ0332T5E)
R90  value 330R  [RES_0603]  (hidden comment: 0603SAF3300T5E)
R91  value 100R  [RES_0603]  (hidden comment: 0603SAF1000T5E)
R92  value 510R  [RES_0603]  (hidden comment: 0603SAF5100T5E)
R93  value 10K  [RES_0603]  (hidden comment: 0603SAF1002T5E)
U25  LTV-247  [16-SOIC(4.40mm Width)]  (part A of 4)

### Ports
INPUT1 (in), Input1_IN (in), INPUT_COM (in)

### Nets
+3V3: U25.16(C)
BATGND: C91.1 D22.2 R92.1 U25.2(K) ; port INPUT_COM
GND: C92.1 R93.1
Digital_IN1: R89.1 ; port Input1_IN
INPUT1: C92.2 R91.2 ; port INPUT1
NetC91_2: C91.2 D22.1 R89.2 R90.1 R92.2
NetR90_2: R90.2 U25.1(A)
NetR91_1: R91.1 R93.2 U25.15(E)

### Notes on the sheet
- Title
- Size:
- Date:
- A4
- Number:
- Rev.Number:
- Revision:
- Drawer/
- Sheet
- of
- YALIM
- Burak
- TURKEY
- File:

### Library data of the parts
C91 = CL10B104KB8NNNL: as C62 on sheet 07_LTE_GNSS; Supplier 1: OZDISAN; Manufacturer Part Number: CL10B104KB8NNNL
C92 = CL10B102KB8NNNL: MLCC (1608) 0603 1nF 50VDC ±10% X7R; Manufacturer: SAMSUNG; Supplier 1: OZDISAN; Manufacturer Part Number: CL10B102KB8NNNL
D22 = P4SMAJ33A_R1_00001: DIODE TVS 400W 33V DO-214AC SMA PANJIT; Supplier 1: OZDISAN; Manufacturer Part Number: P4SMAJ33A_R1_00001; Manufacturer: PANJIT
R89 = 0603SAJ0332T5E: RES.(1608) 0603 3.3K Ohms 5% 1/10W-S 100PPM; Manufacturer: ROYALOHM; Supplier 1: Ozdisan; Manufacturer Part Number: 0603SAJ0332T5E
R90 = 0603SAF3300T5E: as R26 on sheet 03_MCU_ESP32P4; Supplier 1: Ozdisan; Manufacturer Part Number: 0603SAF3300T5E
R91 = 0603SAF1000T5E: RES.(1608) 0603 100 Ohms 1% 1/10W-S 200PPM; Manufacturer: ROYALOHM; Supplier 1: Ozdisan; Manufacturer Part Number: 0603SAF1000T5E
R92 = 0603SAF5100T5E: RES.(1608) 0603 510 Ohms 1% 1/10W-S 100PPM; Manufacturer: ROYALOHM; Supplier 1: Ozdisan; Manufacturer Part Number: 0603SAF5100T5E
R93 = 0603SAF1002T5E: as R61 on sheet 07_LTE_GNSS; Supplier 1: Ozdisan; Manufacturer Part Number: 0603SAF1002T5E
U25 = LTV-247: Optoisolator Transistor Output 3750Vrms 4 Channel 16-SO; Manufacturer: Lite-On Inc.; Supplier 1: Digi-Key; Value: *; Manufacturer Part Number: LTV-247